# Altium project Flight Controller Core.PrjPcb (part 1 of 2)
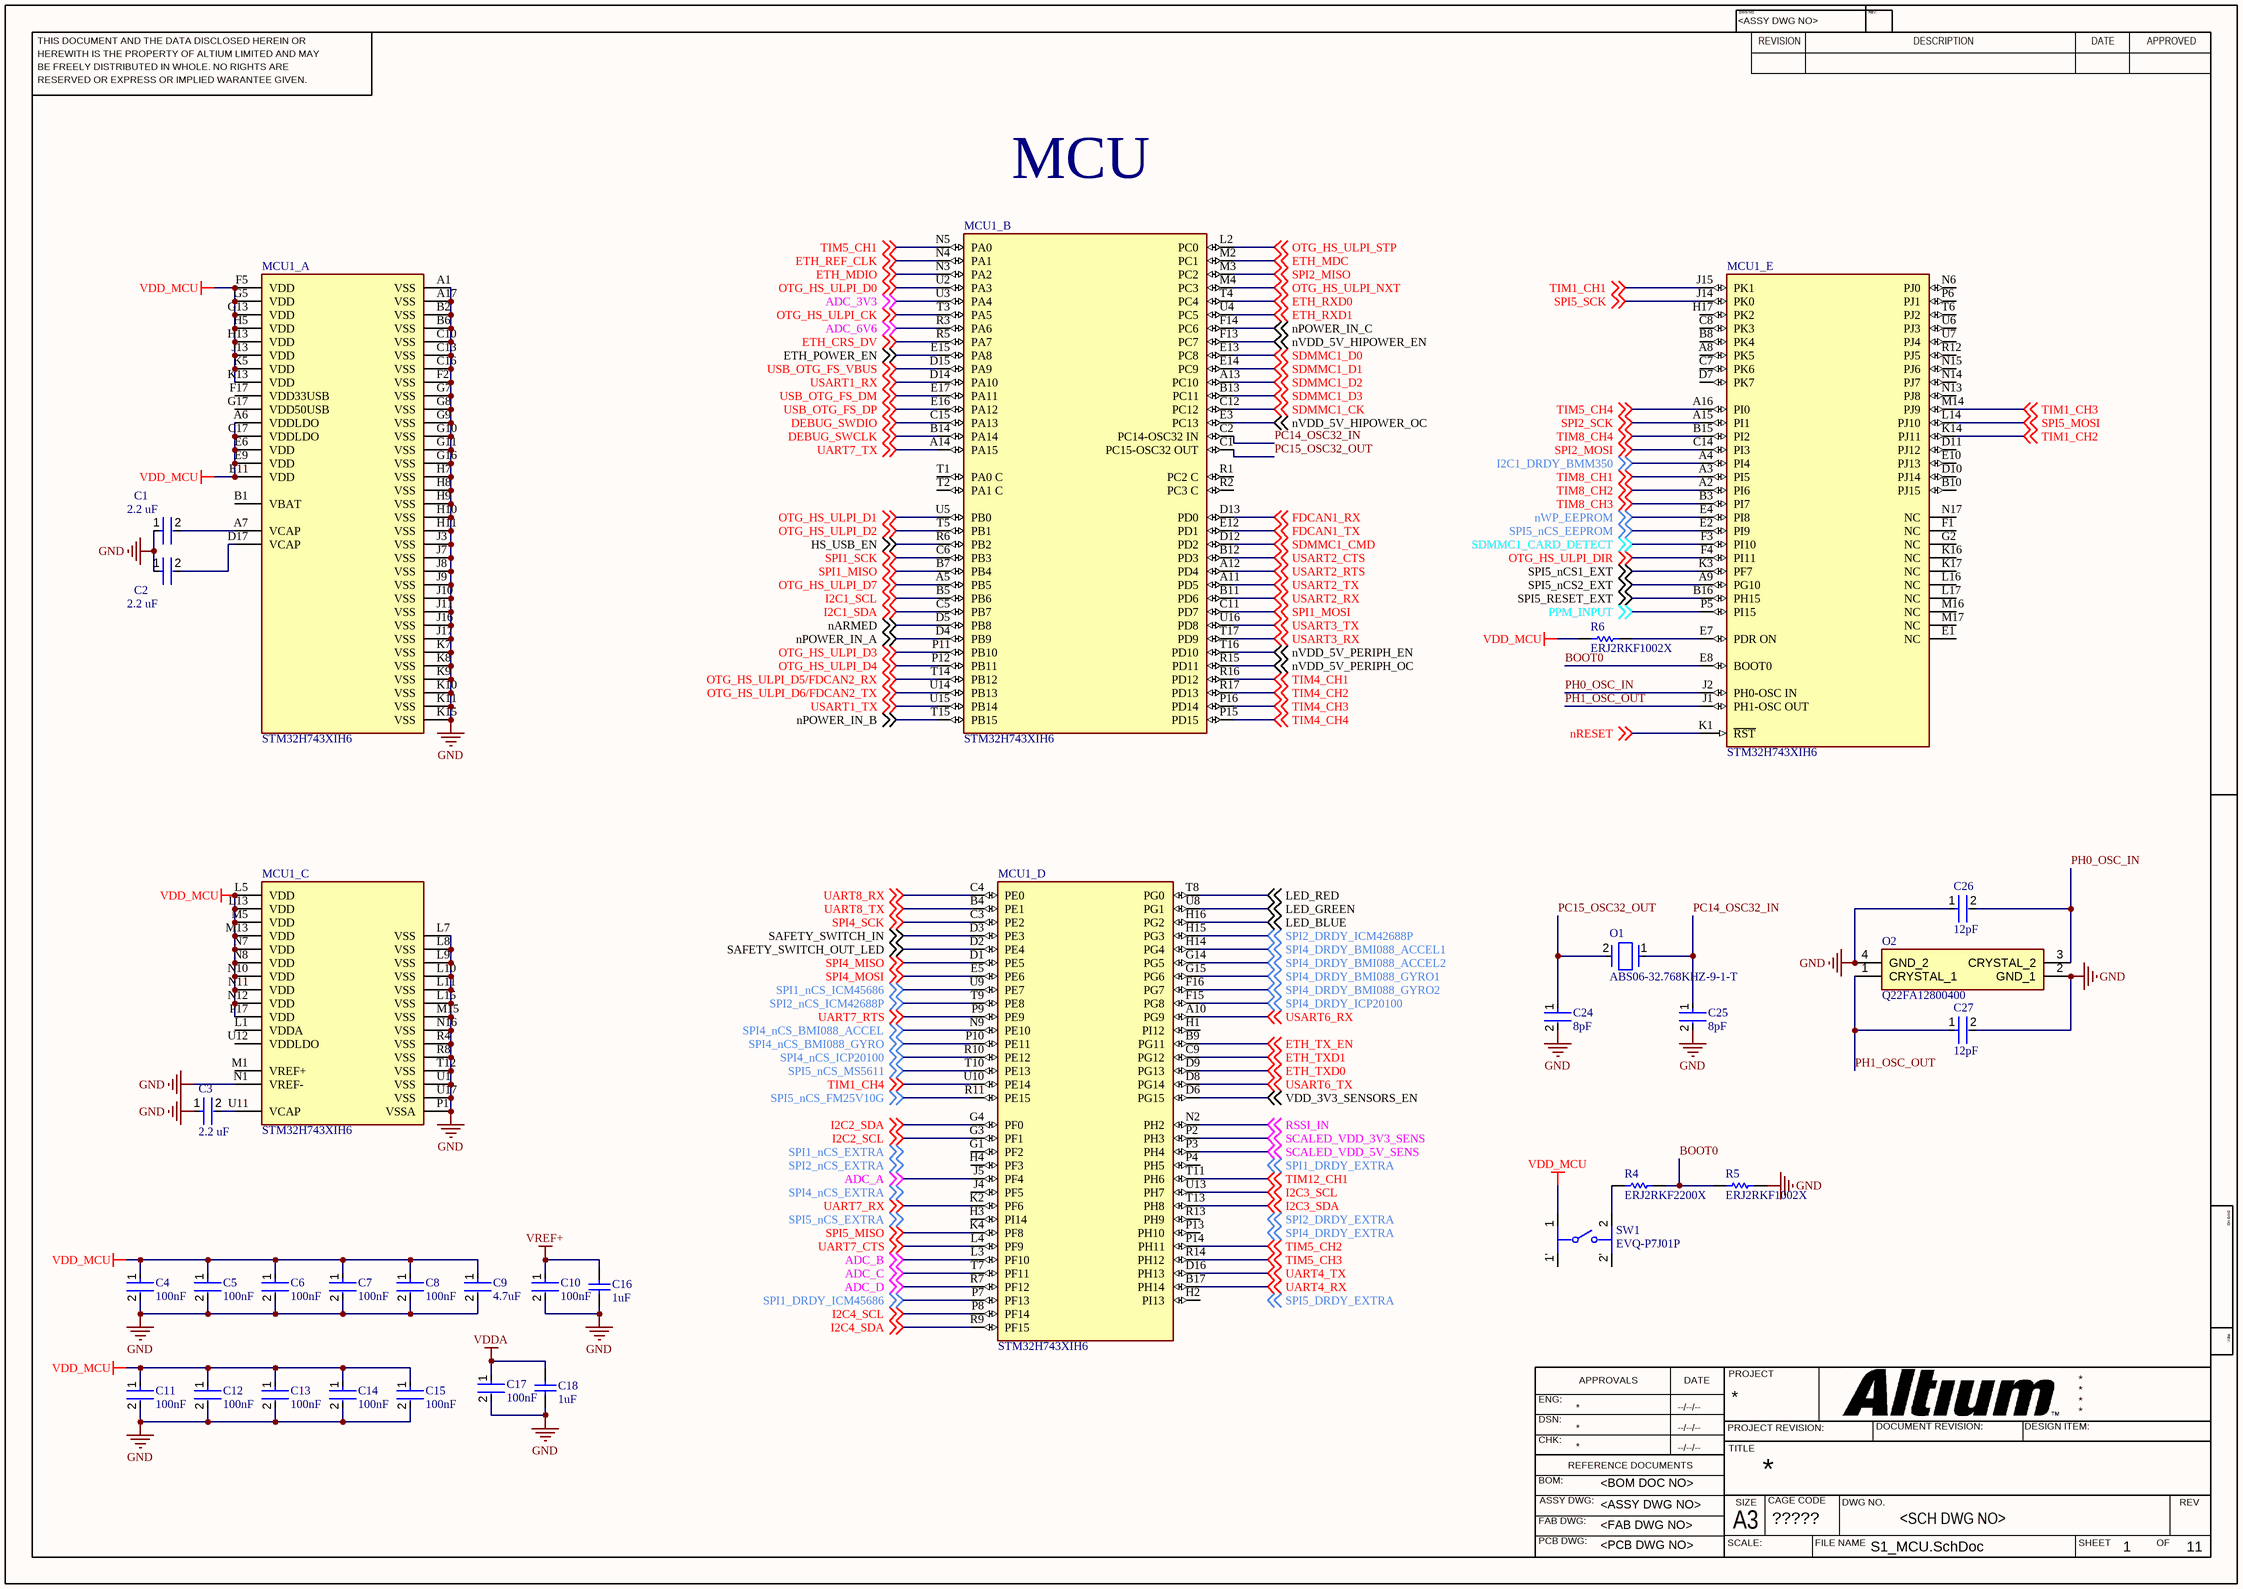
[diagram p0: S1_MCU.SchDoc]
CAGE_CODE: ?????; CONTRACT_NUMBER: <CONTRACT NO>; DOC_NO_ASSY_DWG: <ASSY DWG NO>; DOC_NO_BOM: <BOM DOC NO>; DOC_NO_FAB_DWG: <FAB DWG NO>; DOC_NO_SCH_DWG: <SCH DWG NO>; PCB_2_DEC_TOL: +/-.01; PCB_3_DEC_TOL: +/-.010; PCB_ANG_TOL: +/-1/2; PCB_ASSEMBLY_NO: <PCB ASSY NO>; PCB_CHECKER: - -----; PCB_CHECKER_APP_DATE: --/--/----; PCB_DESIGNER: - -----; PCB_DESIGNER_APP_DATE: --/--/----; PCB_DWG_NO: <PCB DWG NO>; PCB_ENGINEER: - -----; PCB_ENGINEER_APP_DATE: --/--/----; PCB_PART_NUMBER: <PCB PN>; PCB_REV: A; SCH_REV: A
12 sheets, 165 parts. Net scope: global (net labels, ports and power ports of the same name join across sheets).
Sheets:
  S1_MCU.SchDoc
  S2_Power.SchDoc
  S3_Imu.SchDoc
  S5_Memory_Ram.SchDoc
  S4_Baro_Mag.SchDoc
  S6_Pwm.SchDoc
  S7_Uart.SchDoc
  S8_Usb_Select.SchDoc
  S9_Can.SchDoc
  S10_Adc.SchDoc
  S11_Busses.SchDoc
  S12_Connectors.SchDoc

## Sheet S1_MCU.SchDoc
size 420 x 297 mm; ENG_APP_DATE: --/--/--; DSN_APP_DATE: --/--/--; CHK_APP_DATE: --/--/--; ApprovedBy: HITESH; SheetNumber: 1; SheetTotal: 11

### Parts
C1  2.2 uF  [FP-C1005-050-IPC_A]
C2  2.2 uF  [FP-C1005-050-IPC_A]
C3  2.2 uF  [FP-C1005-050-IPC_A]
C4  100nF  [FP-CC0402-MFG]
C5  100nF  [FP-CC0402-MFG]
C6  100nF  [FP-CC0402-MFG]
C7  100nF  [FP-CC0402-MFG]
C8  100nF  [FP-CC0402-MFG]
C9  4.7uF  [FP-CC0402-MFG]
C10  100nF  [FP-CC0402-MFG]
C11  100nF  [FP-CC0402-MFG]
C12  100nF  [FP-CC0402-MFG]
C13  100nF  [FP-CC0402-MFG]
C14  100nF  [FP-CC0402-MFG]
C15  100nF  [FP-CC0402-MFG]
C16  1uF  [CAPC0402(1005)60_L]
C17  100nF  [FP-CC0402-MFG]
C18  1uF  [CAPC0402(1005)60_L]
C24  8pF  [FP-GJM155-0_05-IPC_C]
C25  8pF  [FP-GJM155-0_05-IPC_C]
C26  12pF  [FP-GRM155-0_05-MFG]
C27  12pF  [FP-GRM155-0_05-MFG]
MCU1_  STM32H743XIH6  [FP-TFBGA240+25-A07U-MFG]  (parts A,B,C,D,E of 5)
O1  ABS06-32.768KHZ-9-1-T  [FP-ABS06-MFG]
O2  Q22FA12800400  [Q22FA12800400]
R4  ERJ2RKF2200X  [RESC1005X40X25LL05T05]
R5  ERJ2RKF1002X  [RESC1005X40X25LL05T05]
R6  ERJ2RKF1002X  [RESC1005X40X25LL05T05]
SW1  EVQ-P7J01P  [FP-EVQ-P7J01P-MFG]

### Nets
GND: C1.1 C2.1 C3.1 C4.2 C5.2 C6.2 C7.2 C8.2 C9.2 C10.2 C11.2 C12.2 C13.2 C14.2 C15.2 C16.2 C17.2 C18.2 C24.2 C25.2 C26.1 C27.2 MCU1_.A1(VSS) MCU1_.A17(VSS) MCU1_.B2(VSS) MCU1_.B6(VSS) MCU1_.C10(VSS) MCU1_.C13(VSS) MCU1_.C16(VSS) MCU1_.F2(VSS) MCU1_.G7(VSS) MCU1_.G8(VSS) MCU1_.G9(VSS) MCU1_.G10(VSS) MCU1_.G11(VSS) MCU1_.G16(VSS) MCU1_.H7(VSS) MCU1_.H8(VSS) MCU1_.H9(VSS) MCU1_.H10(VSS) MCU1_.H11(VSS) MCU1_.J3(VSS) MCU1_.J7(VSS) MCU1_.J8(VSS) MCU1_.J9(VSS) MCU1_.J10(VSS) MCU1_.J11(VSS) MCU1_.J16(VSS) MCU1_.J17(VSS) MCU1_.K7(VSS) MCU1_.K8(VSS) MCU1_.K9(VSS) MCU1_.K10(VSS) MCU1_.K11(VSS) MCU1_.K15(VSS) MCU1_.L7(VSS) MCU1_.L8(VSS) MCU1_.L9(VSS) MCU1_.L10(VSS) MCU1_.L11(VSS) MCU1_.L15(VSS) MCU1_.M15(VSS) MCU1_.N1(VREF-) MCU1_.N16(VSS) MCU1_.P1(VSSA) MCU1_.R4(VSS) MCU1_.R8(VSS) MCU1_.T12(VSS) MCU1_.U1(VSS) MCU1_.U17(VSS) O2.2(GND_1) O2.4(GND_2) R5.1
VDD_MCU: C4.1 C5.1 C6.1 C7.1 C8.1 C9.1 C11.1 C12.1 C13.1 C14.1 C15.1 MCU1_.A6(VDDLDO) MCU1_.C17(VDDLDO) MCU1_.E6(VDD) MCU1_.E9(VDD) MCU1_.E11(VDD) MCU1_.F5(VDD) MCU1_.G5(VDD) MCU1_.G13(VDD) MCU1_.H5(VDD) MCU1_.H13(VDD) MCU1_.J13(VDD) MCU1_.K5(VDD) MCU1_.K13(VDD) MCU1_.L5(VDD) MCU1_.L13(VDD) MCU1_.M5(VDD) MCU1_.M13(VDD) MCU1_.N7(VDD) MCU1_.N8(VDD) MCU1_.N10(VDD) MCU1_.N11(VDD) MCU1_.N12(VDD) MCU1_.P17(VDD) R6.2 SW1.1
VDDA: C17.1 C18.1
VREF+: C10.1 C16.1
ADC_3V3: MCU1_.U3(PA4) ; off-sheet ADC_3V3
ADC_6V6: MCU1_.R3(PA6) ; off-sheet ADC_6V6
ADC_A: MCU1_.J5(PF4) ; off-sheet ADC_A
ADC_B: MCU1_.L3(PF10) ; off-sheet ADC_B
ADC_C: MCU1_.T7(PF11) ; off-sheet ADC_C
ADC_D: MCU1_.R7(PF12) ; off-sheet ADC_D
BOOT0: MCU1_.E8(BOOT0) R4.2 R5.2
DEBUG_SWCLK: MCU1_.B14(PA14) ; off-sheet DEBUG_SWCLK
DEBUG_SWDIO: MCU1_.C15(PA13) ; off-sheet DEBUG_SWDIO
ETH_CRS_DV: MCU1_.R5(PA7) ; off-sheet ETH_CRS_DV
ETH_MDC: MCU1_.M2(PC1) ; off-sheet ETH_MDC
ETH_MDIO: MCU1_.N3(PA2) ; off-sheet ETH_MDIO
ETH_POWER_EN: MCU1_.E15(PA8) ; off-sheet ETH_POWER_EN
ETH_REF_CLK: MCU1_.N4(PA1) ; off-sheet ETH_REF_CLK
ETH_RXD0: MCU1_.T4(PC4) ; off-sheet ETH_RXD0
ETH_RXD1: MCU1_.U4(PC5) ; off-sheet ETH_RXD1
ETH_TX_EN: MCU1_.B9(PG11) ; off-sheet ETH_TX_EN
ETH_TXD0: MCU1_.D9(PG13) ; off-sheet ETH_TXD0
ETH_TXD1: MCU1_.C9(PG12) ; off-sheet ETH_TXD1
FDCAN1_RX: MCU1_.D13(PD0) ; off-sheet FDCAN1_RX
FDCAN1_TX: MCU1_.E12(PD1) ; off-sheet FDCAN1_TX
HS_USB_EN: MCU1_.R6(PB2) ; off-sheet HS_USB_EN
I2C1_DRDY_BMM350: MCU1_.A4(PI4) ; off-sheet I2C1_DRDY_BMM350
I2C1_SCL: MCU1_.B5(PB6) ; off-sheet I2C1_SCL
I2C1_SDA: MCU1_.C5(PB7) ; off-sheet I2C1_SDA
I2C2_SCL: MCU1_.G3(PF1) ; off-sheet I2C2_SCL
I2C2_SDA: MCU1_.G4(PF0) ; off-sheet I2C2_SDA
I2C3_SCL: MCU1_.U13(PH7) ; off-sheet I2C3_SCL
I2C3_SDA: MCU1_.T13(PH8) ; off-sheet I2C3_SDA
I2C4_SCL: MCU1_.P8(PF14) ; off-sheet I2C4_SCL
I2C4_SDA: MCU1_.R9(PF15) ; off-sheet I2C4_SDA
LED_BLUE: MCU1_.H16(PG2) ; off-sheet LED_BLUE
LED_GREEN: MCU1_.U8(PG1) ; off-sheet LED_GREEN
LED_RED: MCU1_.T8(PG0) ; off-sheet LED_RED
nARMED: MCU1_.D5(PB8) ; off-sheet nARMED
nPOWER_IN_A: MCU1_.D4(PB9) ; off-sheet nPOWER_IN_A
nPOWER_IN_B: MCU1_.T15(PB15) ; off-sheet nPOWER_IN_B
nPOWER_IN_C: MCU1_.F14(PC6) ; off-sheet nPOWER_IN_C
nRESET: MCU1_.K1(~{RST}) ; off-sheet nRESET
nVDD_5V_HIPOWER_EN: MCU1_.F13(PC7) ; off-sheet nVDD_5V_HIPOWER_EN
nVDD_5V_HIPOWER_OC: MCU1_.E3(PC13) ; off-sheet nVDD_5V_HIPOWER_OC
nVDD_5V_PERIPH_EN: MCU1_.T16(PD10) ; off-sheet nVDD_5V_PERIPH_EN
nVDD_5V_PERIPH_OC: MCU1_.R15(PD11) ; off-sheet nVDD_5V_PERIPH_OC
nWP_EEPROM: MCU1_.E4(PI8) ; off-sheet nWP_EEPROM
OTG_HS_ULPI_CK: MCU1_.T3(PA5) ; off-sheet OTG_HS_ULPI_CK
OTG_HS_ULPI_D0: MCU1_.U2(PA3) ; off-sheet OTG_HS_ULPI_D0
OTG_HS_ULPI_D1: MCU1_.U5(PB0) ; off-sheet OTG_HS_ULPI_D1
OTG_HS_ULPI_D2: MCU1_.T5(PB1) ; off-sheet OTG_HS_ULPI_D2
OTG_HS_ULPI_D3: MCU1_.P11(PB10) ; off-sheet OTG_HS_ULPI_D3
OTG_HS_ULPI_D4: MCU1_.P12(PB11) ; off-sheet OTG_HS_ULPI_D4
OTG_HS_ULPI_D5/FDCAN2_RX: MCU1_.T14(PB12) ; off-sheet OTG_HS_ULPI_D5/FDCAN2_RX
OTG_HS_ULPI_D6/FDCAN2_TX: MCU1_.U14(PB13) ; off-sheet OTG_HS_ULPI_D6/FDCAN2_TX
OTG_HS_ULPI_D7: MCU1_.A5(PB5) ; off-sheet OTG_HS_ULPI_D7
OTG_HS_ULPI_DIR: MCU1_.F4(PI11) ; off-sheet OTG_HS_ULPI_DIR
OTG_HS_ULPI_NXT: MCU1_.M4(PC3) ; off-sheet OTG_HS_ULPI_NXT
OTG_HS_ULPI_STP: MCU1_.L2(PC0) ; off-sheet OTG_HS_ULPI_STP
PC14_OSC32_IN: C25.1 MCU1_.C2(PC14-OSC32_IN) O1.1
PC15_OSC32_OUT: C24.1 MCU1_.C1(PC15-OSC32_OUT) O1.2
PH0_OSC_IN: C26.2 MCU1_.J2(PH0-OSC_IN) O2.3(CRYSTAL_2)
PH1_OSC_OUT: C27.1 MCU1_.J1(PH1-OSC_OUT) O2.1(CRYSTAL_1)
PPM_INPUT: MCU1_.P5(PI15) ; off-sheet PPM_INPUT
RSSI_IN: MCU1_.N2(PH2) ; off-sheet RSSI_IN
SAFETY_SWITCH_IN: MCU1_.D3(PE3) ; off-sheet SAFETY_SWITCH_IN
SAFETY_SWITCH_OUT_LED: MCU1_.D2(PE4) ; off-sheet SAFETY_SWITCH_OUT_LED
SCALED_VDD_3V3_SENS: MCU1_.P2(PH3) ; off-sheet SCALED_VDD_3V3_SENS
SCALED_VDD_5V_SENS: MCU1_.P3(PH4) ; off-sheet SCALED_VDD_5V_SENS
SDMMC1_CARD_DETECT: MCU1_.F3(PI10) ; off-sheet SDMMC1_CARD_DETECT
SDMMC1_CK: MCU1_.C12(PC12) ; off-sheet SDMMC1_CK
SDMMC1_CMD: MCU1_.D12(PD2) ; off-sheet SDMMC1_CMD
SDMMC1_D0: MCU1_.E13(PC8) ; off-sheet SDMMC1_D0
SDMMC1_D1: MCU1_.E14(PC9) ; off-sheet SDMMC1_D1
SDMMC1_D2: MCU1_.A13(PC10) ; off-sheet SDMMC1_D2
SDMMC1_D3: MCU1_.B13(PC11) ; off-sheet SDMMC1_D3
SPI1_DRDY_ICM45686: MCU1_.P7(PF13) ; off-sheet SPI1_DRDY_ICM45686
SPI1_MISO: MCU1_.B7(PB4) ; off-sheet SPI1_MISO
SPI1_MOSI: MCU1_.C11(PD7) ; off-sheet SPI1_MOSI
SPI1_nCS_ICM45686: MCU1_.U9(PE7) ; off-sheet SPI1_nCS_ICM45686
SPI1_SCK: MCU1_.C6(PB3) ; off-sheet SPI1_SCK
SPI2_DRDY_ICM42688P: MCU1_.H15(PG3) ; off-sheet SPI2_DRDY_ICM42688P
SPI2_MISO: MCU1_.M3(PC2) ; off-sheet SPI2_MISO
SPI2_MOSI: MCU1_.C14(PI3) ; off-sheet SPI2_MOSI
SPI2_nCS_ICM42688P: MCU1_.T9(PE8) ; off-sheet SPI2_nCS_ICM42688P
SPI2_SCK: MCU1_.A15(PI1) ; off-sheet SPI2_SCK
SPI4_DRDY_BMI088_ACCEL1: MCU1_.H14(PG4) ; off-sheet SPI4_DRDY_BMI088_ACCEL1
SPI4_DRDY_BMI088_ACCEL2: MCU1_.G14(PG5) ; off-sheet SPI4_DRDY_BMI088_ACCEL2
SPI4_DRDY_BMI088_GYRO1: MCU1_.G15(PG6) ; off-sheet SPI4_DRDY_BMI088_GYRO1
SPI4_DRDY_BMI088_GYRO2: MCU1_.F16(PG7) ; off-sheet SPI4_DRDY_BMI088_GYRO2
SPI4_DRDY_ICP20100: MCU1_.F15(PG8) ; off-sheet SPI4_DRDY_ICP20100
SPI4_MISO: MCU1_.D1(PE5) ; off-sheet SPI4_MISO
SPI4_MOSI: MCU1_.E5(PE6) ; off-sheet SPI4_MOSI
SPI4_nCS_BMI088_ACCEL: MCU1_.N9(PE10) ; off-sheet SPI4_nCS_BMI088_ACCEL
SPI4_nCS_BMI088_GYRO: MCU1_.P10(PE11) ; off-sheet SPI4_nCS_BMI088_GYRO
SPI4_nCS_ICP20100: MCU1_.R10(PE12) ; off-sheet SPI4_nCS_ICP20100
SPI4_SCK: MCU1_.C3(PE2) ; off-sheet SPI4_SCK
SPI5_MISO: MCU1_.K4(PF8) ; off-sheet SPI5_MISO
SPI5_MOSI: MCU1_.L14(PJ10) ; off-sheet SPI5_MOSI
SPI5_nCS1_EXT: MCU1_.K3(PF7) ; off-sheet SPI5_nCS1_EXT
SPI5_nCS2_EXT: MCU1_.A9(PG10) ; off-sheet SPI5_nCS2_EXT
SPI5_nCS_EEPROM: MCU1_.E2(PI9) ; off-sheet SPI5_nCS_EEPROM
SPI5_nCS_FM25V10G: MCU1_.R11(PE15) ; off-sheet SPI5_nCS_FM25V10G
SPI5_nCS_MS5611: MCU1_.T10(PE13) ; off-sheet SPI5_nCS_MS5611
SPI5_RESET_EXT: MCU1_.B16(PH15) ; off-sheet SPI5_RESET_EXT
SPI5_SCK: MCU1_.J14(PK0) ; off-sheet SPI5_SCK
TIM1_CH1: MCU1_.J15(PK1) ; off-sheet TIM1_CH1
TIM1_CH2: MCU1_.K14(PJ11) ; off-sheet TIM1_CH2
TIM1_CH3: MCU1_.M14(PJ9) ; off-sheet TIM1_CH3
TIM1_CH4: MCU1_.U10(PE14) ; off-sheet TIM1_CH4
TIM4_CH1: MCU1_.R16(PD12) ; off-sheet TIM4_CH1
TIM4_CH2: MCU1_.R17(PD13) ; off-sheet TIM4_CH2
TIM4_CH3: MCU1_.P16(PD14) ; off-sheet TIM4_CH3
TIM4_CH4: MCU1_.P15(PD15) ; off-sheet TIM4_CH4
TIM5_CH1: MCU1_.N5(PA0) ; off-sheet TIM5_CH1
TIM5_CH2: MCU1_.P14(PH11) ; off-sheet TIM5_CH2
TIM5_CH3: MCU1_.R14(PH12) ; off-sheet TIM5_CH3
TIM5_CH4: MCU1_.A16(PI0) ; off-sheet TIM5_CH4
TIM8_CH1: MCU1_.A3(PI5) ; off-sheet TIM8_CH1
TIM8_CH2: MCU1_.A2(PI6) ; off-sheet TIM8_CH2
TIM8_CH3: MCU1_.B3(PI7) ; off-sheet TIM8_CH3
TIM8_CH4: MCU1_.B15(PI2) ; off-sheet TIM8_CH4
TIM12_CH1: MCU1_.T11(PH6) ; off-sheet TIM12_CH1
UART4_RX: MCU1_.B17(PH14) ; off-sheet UART4_RX
UART4_TX: MCU1_.D16(PH13) ; off-sheet UART4_TX
UART7_CTS: MCU1_.L4(PF9) ; off-sheet UART7_CTS
UART7_RTS: MCU1_.P9(PE9) ; off-sheet UART7_RTS
UART7_RX: MCU1_.K2(PF6) ; off-sheet UART7_RX
UART7_TX: MCU1_.A14(PA15) ; off-sheet UART7_TX
UART8_RX: MCU1_.C4(PE0) ; off-sheet UART8_RX
UART8_TX: MCU1_.B4(PE1) ; off-sheet UART8_TX
USART1_RX: MCU1_.D14(PA10) ; off-sheet USART1_RX
USART1_TX: MCU1_.U15(PB14) ; off-sheet USART1_TX
USART2_CTS: MCU1_.B12(PD3) ; off-sheet USART2_CTS
USART2_RTS: MCU1_.A12(PD4) ; off-sheet USART2_RTS
USART2_RX: MCU1_.B11(PD6) ; off-sheet USART2_RX
USART2_TX: MCU1_.A11(PD5) ; off-sheet USART2_TX
USART3_RX: MCU1_.T17(PD9) ; off-sheet USART3_RX
USART3_TX: MCU1_.U16(PD8) ; off-sheet USART3_TX
USART6_RX: MCU1_.A10(PG9) ; off-sheet USART6_RX
USART6_TX: MCU1_.D8(PG14) ; off-sheet USART6_TX
USB_OTG_FS_DM: MCU1_.E17(PA11) ; off-sheet USB_OTG_FS_DM
USB_OTG_FS_DP: MCU1_.E16(PA12) ; off-sheet USB_OTG_FS_DP
USB_OTG_FS_VBUS: MCU1_.D15(PA9) ; off-sheet USB_OTG_FS_VBUS
VDD_3V3_SENSORS_EN: MCU1_.D6(PG15) ; off-sheet VDD_3V3_SENSORS_EN
NetC1_2: C1.2 MCU1_.A7(VCAP)
NetC2_2: C2.2 MCU1_.D17(VCAP)
NetC3_2: C3.2 MCU1_.U11(VCAP)
NetMCU1__E7: MCU1_.E7(PDR_ON) R6.1
NetR4_1: R4.1 SW1.2

Not connected (* = marked no-connect by the designer): MCU1_ A8(PK5) B1(VBAT) B8(PK4) B10(PJ15) C7(PK6) C8(PK3) D7(PK7) D10(PJ14) D11(PJ12) E1(NC) E10(PJ13) F1(NC) F17(VDD33USB) G1(PF2) G2(NC) G17(VDD50USB) H1(PI12) H2(PI13) H3(PI14) H4(PF3) H17(PK2) J4(PF5) K16(NC) K17(NC) L1(VDDA) L16(NC) L17(NC) M1(VREF+) M16(NC) M17(NC) N6(PJ0) N13(PJ8) N14(PJ7) N15(PJ6) N17(NC) P4(PH5) P6(PJ1) P13(PH10) R1(PC2_C) R2(PC3_C) R12(PJ5) R13(PH9) T1(PA0_C) T2(PA1_C) T6(PJ2) U6(PJ3) U7(PJ4) U12(VDDLDO); SW1 1' 2'

### Notes on the sheet
- MCU
- Labels drawn without touching a wire or pin: SPI1_DRDY_EXTRA, SPI1_nCS_EXTRA, SPI2_DRDY_EXTRA, SPI2_nCS_EXTRA, SPI4_DRDY_EXTRA, SPI4_nCS_EXTRA, SPI5_DRDY_EXTRA, SPI5_nCS_EXTRA
- THIS DOCUMENT AND THE DATA DISCLOSED HEREIN OR
- HEREWITH IS THE PROPERTY OF ALTIUM LIMITED AND MAY
- DWG NO:
- REVISION
- REV:
- DESCRIPTION
- DATE
- APPROVED
- BE FREELY DISTRIBUTED IN WHOLE. NO RIGHTS ARE
- RESERVED OR EXPRESS OR IMPLIED WARANTEE GIVEN.
- ENG:
- APPROVALS
- PROJECT
- DSN:
- CHK:
- REFERENCE DOCUMENTS
- PROJECT REVISION:
- TITLE
- DOCUMENT REVISION:
- DESIGN ITEM:
- BOM:
- FAB DWG:
- PCB DWG:
- ASSY DWG:
- SCALE:
- A3
- SIZE
- CAGE CODE
- FILE NAME
- DWG NO.
- SHEET
- OF
- REV

### Library data of the parts
C1-C3 = CMP-08246-004339-1: CAP CER 2.2UF 25V X5R 0402; Dielectric Material: Ceramic; Tolerance: 10%; REACH SVHC: No SVHC; Weight: 2.3E-05oz; Capacitance: 2.2uF; Length: 1mm; RoHS Compliant: Yes; Package Quantity: 1; Voltage Rating (DC): 25V; Dielectric: X5R; Series: C; Voltage Rating: 25V; Case Code (Imperial): 0402; Min Operating Temperature: -55°C; Depth: 0.5mm; Resistor Type: Ceramic; Height: 0.5mm; Width: 0.5mm; Mount: Surface Mount; Case Code (Metric): 1005; Case/Package: 0402; Max Operating Temperature: 85°C; Thickness: 0.022inch; Lead Free: Lead Free; Termination: SMD/SMT; Packaging: Tape and Reel
C4-C8 C10-C15 C17 = CMP-03422-001121-1: CAP CER 0.1UF 16V X7R 0402; Manufacturer: YAGEO; Manufacturer Part Number: CC0402KPX7R7BB104; Material: Ceramic; Temperature Coefficient: 30ppm/°C; Automotive Grade: NA; Tolerance: 0.1; Digikey Description: CAP CER 0.1UF 16V X7R 0402; Temperature Range Low: -55°C; Footprint Url: http://www.yageo.com/exep/pages/download/literatures/UPY-C_GEN_24.pdf; RoHS: TRUE; Device Class L3: Ceramic Capacitors; Temperature Characteristic: X7R; Capacitance: 100 nF; Package: CC0402; Device Class L1: Passive Components; Lead Free: Yes; Temperature Range High: +125°C; Category: Cap; Mouser Description: 0402 0.1 uF 16 V ±10% Tolerance X7R SMT Multilayer Ceramic Capacitor; Voltage Rating: 16 V; Value: 100 nF; ComponentLink2Description: Datasheet; Automotive: No; Octopart: https://octopart.com/cc0402kpx7r7bb104-yageo-21548559; ComponentLink2URL: http://www.yageo.com/documents/recent/UPY-GP_NP0_16V-to-50V_16.pdf; Height: 0.55mm; Device Class L2: Capacitors; Temperature: -55°C to +125°C; Ipc Land Pattern Name: CAPC10050X50
C9 = CMP-1034-02137-2: CAP CER 4.7UF 6.3V X5R 0402; Manufacturer: YAGEO; Manufacturer Part Number: CC0402MRX5R5BB475; Temperature Coefficient: 30ppm/°C; Tolerance: 0.2; Automotive Grade: NA; Material: Ceramic; Automotive: No; Temperature: -55°C to +125°C; Category: Cap; Ipc Land Pattern Name: CAPC10050X50; Digikey Description: CAP CER 4.7UF 6.3V X5R 0402; ComponentLink2Description: Datasheet; Octopart: https://octopart.com/cc0402mrx5r5bb475-yageo-20021081; Mouser Description: Multilayer Ceramic Capacitors MLCC - SMD/SMT 4.7uF 6.3V X5R 20%; Device Class L1: Passive Components; Footprint Url: http://www.yageo.com/exep/pages/download/literatures/UPY-C_GEN_24.pdf; Value: 4.7 uF; Temperature Range High: +125°C; ComponentLink2URL: http://www.yageo.com/documents/recent/UPY-GP_NP0_16V-to-50V_16.pdf; Voltage Rating: 6.3 V; Height: 0.55mm; RoHS: TRUE; Package: CC0402; Device Class L3: Ceramic Capacitors; Temperature Characteristic: X5R; Temperature Range Low: -55°C; Capacitance: 4.7 uF; Device Class L2: Capacitors; Lead Free: Yes
C16 C18 = CMP-1034-02115-1: CAP 1uF 6.3V -20% to +80% 0402 (1005 Metric) Thickness 0.6mm SMD; Case-EIA: 0402; Case-Metric: 1005; Rated Voltage: 6.3 V; Tolerance: -20% to +80%; Technology: SMT; Max Thickness: 0.6 mm; Value: 1uF
C24 C25 = CMP-2008-03759-2: Multi-Layer Ceramic Capacitor 8pF C0G  ±0.25pF 0402 Paper T/R; Voltage Rating (DC): 50V; Termination: SMD/SMT; Dielectric: C0G; Packaging: Tape and Reel; Width: 0.02inch; Thickness: 0.022inch; Case Code (Imperial): 0402; Min Operating Temperature: -55°C; Case Code (Metric): 1005; Voltage Rating: 50V; Capacitance: 8pF; Package Quantity: 1; Lead Free: Lead Free; Max Operating Temperature: 125°C; Mount: Surface Mount; Depth: 0.5mm; Height: 0.5mm; Radiation Hardening: No; Case/Package: 0402; Length: 1mm
C26 C27 = CMP-2008-03945-2: CAP CER 12PF 50V C0G/NP0 0402; Tolerance: 2%; Dielectric: C0G; Material: Ceramic; Termination: SMD/SMT; Mount: Surface Mount; REACH SVHC: No SVHC; Depth: 0.5mm; Case Code (Metric): 1005; Voltage Rating: 50V; Height: 0.5mm; Voltage Rating (DC): 50V; Case Code (Imperial): 0402; Package Quantity: 10000; Construction: Flat; Thickness: 0.022inch; Length: 1mm; Min Operating Temperature: -55°C; Width: 0.5mm; Lead Free: Lead Free; Capacitance: 12pF; Case/Package: 0402; Packaging: Tape and Reel; Series: GRM; Voltage: 50V; Radiation Hardening: No; Max Operating Temperature: 125°C
MCU1_ = CMP-12105-000122-1: IC MCU 32BIT 2MB FLASH TFBGA; Number of I/Os: 168; Core Architecture: ARM; Frequency: 400MHz; Oscillator Type: Internal; Interface: I2C; Peripherals: Brown-out Detect/Reset; Memory Type: FLASH; Packaging: Tray; Min Operating Temperature: -40°C; Max Operating Temperature: 85°C; Memory Size: 2MB; Case/Package: TFBGA; RoHS Compliant: Yes
O1 = CMP-27762-003430-2: Crystal 32.768kHz ±10ppm (Tol) 9pF FUND 90kΩ 2-Pin Mini-CSMD T/R; Series Resistance: 90kR; Series: ABS06; Case/Package: CSMD; Package Quantity: 3000; Load Capacitance: 9pF; Number of Pins: 2; Tolerance: 10ppm; RoHS Compliant: Yes; Depth: 1.2mm; Termination: SMD/SMT; Min Operating Temperature: -40°C; Length: 2mm; Packaging: Tape and Reel; Max Operating Temperature: 85°C; Frequency Tolerance: 10ppm; Width: 1.2mm; ESR (Equivalent Series Resistance): 90kR; Radiation Hardening: No; Frequency: 32.768kHz; REACH SVHC: No SVHC; Mount: Surface Mount; Height: 0.6mm
O2 = Q22FA12800400: Crystal or Oscillator; Manufacturer_Name: Seiko Epson Corporation; Datasheet Link: https://datasheet.lcsc.com/szlcsc/Seiko-Epson-Q22FA12800400_C255875.pdf; Height: 0.5mm; Manufacturer_Part_Number: Q22FA12800400
R4 = CMP-2002-01131-1: Manufacturer: Panasonic; Part Number: ERJ2RKF2200X
R5 R6 = CMP-2000-07588-1: Chip Resistor, 10 KOhm, +/- 1%, 0.1 W, -55 to 155 degC, 0402 (1005 Metric), RoHS, Tape and Reel; Manufacturer: Panasonic; Power Rating: 100mW; Voltage Rating: 50V; Resistance: 10KOhm; Case\/Package: 0402; Temperature Coefficient: 100ppm\/degreesC; RoHSCompliant: True; Lead Free: LeadFree; Package Quantity: 1; Contact Plating: Tin; Length: 1mm; Radiation Hardening: No; REACH SVHC: NoSVHC; Max Operating Temperature: 155degC; Depth: 0.5mm; Case Code (Imperial): 0402; Military Standard: Not; Package Description: 2-Pin Surface Mount Device, Body 1 x 0.5 mm; Termination: SMD/SMT; Case Code (Metric): 1005; Height: 0.35mm; Packaging: TapeandReel; Voltage Rating (DC): 50V; Package Reference: 402; Number of Pins: 2; Tolerance: 1%; Mounting Technology: SurfaceMount; Width: 0.02inch; Mount: SurfaceMount; Datasheet URL: https://industrial.panasonic.com/cdbs/www-data/pdf/RDA0000/AOA0000C304.pdf; Composition: ThickFilm; Datasheet Version: 02/2017; Manufacturer URL: http://www.panasonic.com/; Max Power Dissipation: 100mW; Number of Terminations: 2; Min Operating Temperature: -55degC
SW1 = CMP-05618-000001-1: SWITCH TACTILE SPST-NO 0.05A 12V; Manufacturer: Panasonic; Operating Force: 1.6N; Contact Current Rating: 50mA; Electromechanical Life: 100000Cycles; Contact Resistance: 500mΩ; Height: 1.55mm; Temperature Range Low: -20°C; Device Class L1: Electromechanical; Package: 0; RoHS: TRUE; Category: Switch; ComponentLink2Description: Datasheet; Device Class L2: Switches; Temperature Range High: +70°C; Mount: Surface Mount; Device Class L3: Tactile Switches; Temperature: -20°C to +70°C; Automotive: No; Manufacturer Part Number: EVQ-P7J01P; Mouser Description: Tactile Switches 3.5x2.9mm Right Ang Light Touch Switch; ComponentLink2URL: https://b2b-api.panasonic.eu/file_stream/pids/fileversion/2431; Lead Free: Yes; Octopart: https://octopart.com/evq-p7j01p-panasonic-29917078; Digikey Description: SWITCH TACTILE SPST-NO 0.05A 12V; Voltage Rating Dc: 12V; Throw Configuration: SPST-NO

## Sheet S2_Power.SchDoc
size 420 x 297 mm; SheetNumber: 2; SheetTotal: 11
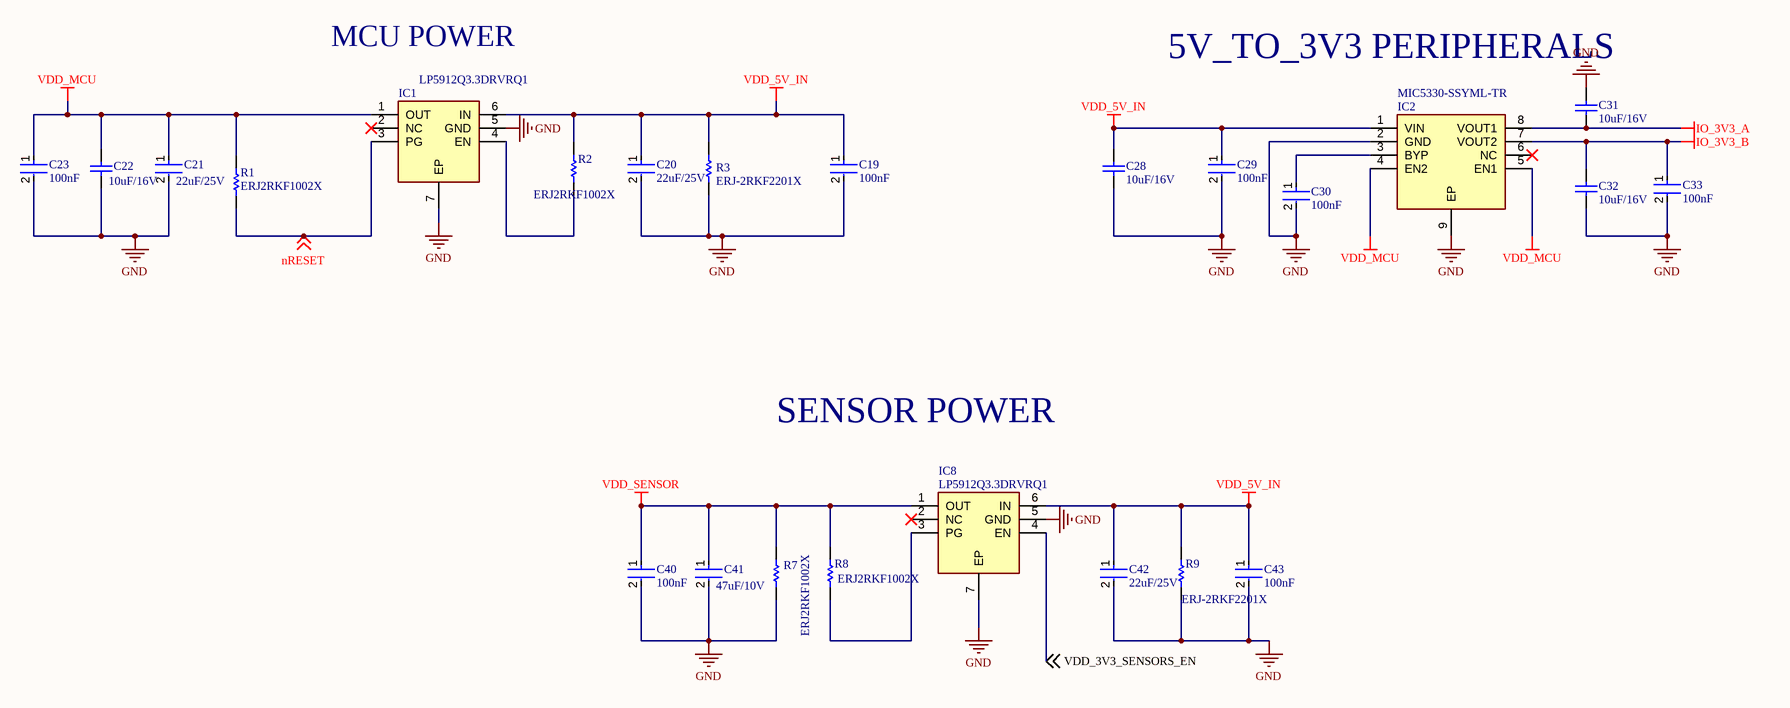
[diagram p1: S2_Power.SchDoc]

### Parts
C19  100nF  [FP-CC0402-MFG]
C20  22uF/25V  [FP-MK325M-MFG]
C21  22uF/25V  [FP-MK325M-MFG]
C22  10uF/16V  [CAPC1210(3225)210_L]
C23  100nF  [FP-CC0402-MFG]
C28  10uF/16V  [CAPC1210(3225)210_L]
C29  100nF  [FP-CC0402-MFG]
C30  100nF  [FP-CC0402-MFG]
C31  10uF/16V  [CAPC1210(3225)210_L]
C32  10uF/16V  [CAPC1210(3225)210_L]
C33  100nF  [FP-CC0402-MFG]
C40  100nF  [FP-CC0402-MFG]
C41  47uF/10V  [FP-C2012-125-0_2-IPC_B]
C42  22uF/25V  [FP-MK325M-MFG]
C43  100nF  [FP-CC0402-MFG]
IC1  LP5912Q3.3DRVRQ1  [SON65P200X200X80-7N]
IC2  MIC5330-SSYML-TR  [SON50P200X200X95-9N-D]
IC8  LP5912Q3.3DRVRQ1  [SON65P200X200X80-7N]
R1  ERJ2RKF1002X  [RESC1005X40X25LL05T05]
R2  ERJ2RKF1002X  [RESC1005X40X25LL05T05]
R3  ERJ-2RKF2201X  [RESC1005X40X25LL05T05]
R7  ERJ2RKF1002X  [RESC1005X40X25LL05T05]
R8  ERJ2RKF1002X  [RESC1005X40X25LL05T05]
R9  ERJ-2RKF2201X  [RESC1005X40X25LL05T05]

### Nets
GND: C19.2 C20.2 C21.2 C22.1 C23.2 C28.1 C29.2 C30.2 C31.1 C32.1 C33.2 C40.2 C41.2 C42.2 C43.2 IC1.5(GND) IC1.7(EP) IC2.2(GND) IC2.9(EP) IC8.5(GND) IC8.7(EP) R3.1 R7.1 R9.1
IO_3V3_A: C31.2 IC2.8(VOUT1)
IO_3V3_B: C32.2 C33.1 IC2.7(VOUT2)
VDD_5V_IN: C19.1 C20.1 C28.2 C29.1 C42.1 C43.1 IC1.6(IN) IC2.1(VIN) IC8.6(IN) R2.2 R3.2 R9.2
VDD_MCU: C21.1 C22.2 C23.1 IC1.1(OUT) IC2.4(EN2) IC2.5(EN1) R1.2
VDD_SENSOR: C40.1 C41.1 IC8.1(OUT) R7.2 R8.2
nRESET: IC1.3(PG) R1.1 ; off-sheet nRESET
VDD_3V3_SENSORS_EN: IC8.4(EN) ; off-sheet VDD_3V3_SENSORS_EN
NetC30_1: C30.1 IC2.3(BYP)
NetIC1_4: IC1.4(EN) R2.1
NetIC8_3: IC8.3(PG) R8.1

Not connected (* = marked no-connect by the designer): IC1 2(NC)*; IC2 6(NC)*; IC8 2(NC)*

### Notes on the sheet
- MCU POWER
- 5V_TO_3V3 PERIPHERALS
- SENSOR POWER
- THIS DOCUMENT AND THE DATA DISCLOSED HEREIN OR
- HEREWITH IS THE PROPERTY OF ALTIUM LIMITED AND MAY
- DWG NO:
- REVISION
- REV:
- DESCRIPTION
- DATE
- APPROVED
- BE FREELY DISTRIBUTED IN WHOLE. NO RIGHTS ARE
- RESERVED OR EXPRESS OR IMPLIED WARANTEE GIVEN.
- ENG:
- APPROVALS
- PROJECT
- DSN:
- CHK:
- REFERENCE DOCUMENTS
- PROJECT REVISION:
- TITLE
- DOCUMENT REVISION:
- DESIGN ITEM:
- BOM:
- FAB DWG:
- PCB DWG:
- ASSY DWG:
- SCALE:
- A3
- SIZE
- CAGE CODE
- FILE NAME
- DWG NO.
- SHEET
- OF
- REV
- (in symbol CMP-1058-00037-1, part A) 7, 8
- (in symbol CMP-1058-00037-1, part B) 5, 6

### Library data of the parts
C19 C23 C29 C30 C33 C40 C43 = CMP-03422-001121-1: as C4 on sheet S1_MCU; Digikey Description: CAP CER 0.1UF 16V X7R 0402; Temperature Range Low: -55°C; Footprint Url: http://www.yageo.com/exep/pages/download/literatures/UPY-C_GEN_24.pdf; RoHS: TRUE; Device Class L3: Ceramic Capacitors; Temperature Characteristic: X7R; Capacitance: 100 nF; Package: CC0402; Device Class L1: Passive Components; Lead Free: Yes; Temperature Range High: +125°C; Category: Cap; Mouser Description: 0402 0.1 uF 16 V ±10% Tolerance X7R SMT Multilayer Ceramic Capacitor; Voltage Rating: 16 V; Value: 100 nF; ComponentLink2Description: Datasheet; Automotive: No; Octopart: https://octopart.com/cc0402kpx7r7bb104-yageo-21548559; ComponentLink2URL: http://www.yageo.com/documents/recent/UPY-GP_NP0_16V-to-50V_16.pdf; Height: 0.55mm; Device Class L2: Capacitors; Temperature: -55°C to +125°C; Ipc Land Pattern Name: CAPC10050X50
C20 C21 C42 = CMP-14477-000145-1: CAP CER 22UF 25V X5R 1210; Tolerance: 20%; Width: 0.098inch; Thickness: 0.106inch; Depth: 2.5mm; Packaging: Tape and Reel; Max Operating Temperature: 85°C; Termination: SMD/SMT; Case Code (Imperial): 1210; Height: 2.5mm; Case/Package: 1210; Voltage Rating: 25V; Package Quantity: 1; Min Operating Temperature: -55°C; Capacitance: 22uF; Halogen Free: Halogen Free; Case Code (Metric): 3225; Mount: Surface Mount; Construction: Flat; Radiation Hardening: No; Length: 3.2mm; Voltage Rating (DC): 25V; Contact Plating: Nickel; Number of Pins: 2; Dielectric: X5R; RoHS Compliant: Yes; Resistor Type: Ceramic; Series: M
C22 C28 C31 C32 = CMP-1038-02215-1: CAP 10uF 16V ±20% 1210 (3225 Metric) Thickness 2.1mm SMD; Case-EIA: 1210; Tolerance: Â±20%; Case-Metric: 3225; Max Thickness: 2.1 mm; Rated Voltage: 16 V; Value: 10uF; Technology: SMT
C41 = CMP-2000-05451-2: Multilayer Ceramic Capacitors 47μF ±20% 10V X5R SMD 0805; Capacitance: 47uF; RoHS Compliant: Yes; Dielectric: X5R; Case Code (Imperial): 0805; Min Operating Temperature: -55°C; Length: 2mm; Voltage Rating: 10V; Lead Free: Lead Free; Weight: 0.000194oz; Resistor Type: Ceramic; Dielectric Material: Ceramic; Max Operating Temperature: 85°C; Height: 1.25mm; Width: 0.049inch; Depth: 1.25mm; Termination: SMD/SMT; Case/Package: 0805; Voltage Rating (DC): 10V; Voltage: 10V; Thickness: 0.057inch; Tolerance: 20%; REACH SVHC: No SVHC; Package Quantity: 1; Series: C; Case Code (Metric): 2012; Mount: Surface Mount; Packaging: Tape and Reel
IC1 IC8 = LP5912Q3.3DRVRQ1: Integrated Circuit; Manufacturer_Name: Texas Instruments; Datasheet Link: http://www.ti.com/lit/gpn/lp5912-q1; Height: 0.8mm; Manufacturer_Part_Number: LP5912Q3.3DRVRQ1; Mouser Part Number: 595-LP5912Q3.3DRVRQ1; Mouser Price/Stock: https://www.mouser.co.uk/ProductDetail/Texas-Instruments/LP5912Q3.3DRVRQ1?qs=n%252BTO0c4TDSb%252BK5JhyfAoLw%3D%3D
IC2 = MIC5330-SSYML-TR: Integrated Circuit; Manufacturer_Name: Microchip; Datasheet Link: http://www.microchip.com/mymicrochip/filehandler.aspx?ddocname=en579824; Height: 0.95mm; Manufacturer_Part_Number: MIC5330-SSYML-TR; Mouser Part Number: 998-MIC5330-SSYMLTR; Mouser Price/Stock: https://www.mouser.co.uk/ProductDetail/Microchip-Technology/MIC5330-SSYML-TR?qs=U6T8BxXiZAVlV%252Bccuslf5g%3D%3D; Arrow Part Number: MIC5330-SSYML-TR; Arrow Price/Stock: https://www.arrow.com/en/products/mic5330-ssyml-tr/microchip-technology?region=nac
R1 R2 R7 R8 = CMP-2000-07588-1: as R5 on sheet S1_MCU; RoHSCompliant: True; Lead Free: LeadFree; Package Quantity: 1; Contact Plating: Tin; Length: 1mm; Radiation Hardening: No; REACH SVHC: NoSVHC; Max Operating Temperature: 155degC; Depth: 0.5mm; Case Code (Imperial): 0402; Military Standard: Not; Package Description: 2-Pin Surface Mount Device, Body 1 x 0.5 mm; Termination: SMD/SMT; Case Code (Metric): 1005; Height: 0.35mm; Packaging: TapeandReel; Voltage Rating (DC): 50V; Package Reference: 402; Number of Pins: 2; Tolerance: 1%; Mounting Technology: SurfaceMount; Width: 0.02inch; Mount: SurfaceMount; Datasheet URL: https://industrial.panasonic.com/cdbs/www-data/pdf/RDA0000/AOA0000C304.pdf; Composition: ThickFilm; Datasheet Version: 02/2017; Manufacturer URL: http://www.panasonic.com/; Max Power Dissipation: 100mW; Number of Terminations: 2; Min Operating Temperature: -55degC
R3 R9 = CMP-2002-01132-2: Precision Thick Film Chip Resistor, 2.2 kOhm, 100 mW, 1%, -55 to 155 degC, 2-Pin SMD (0402), RoHS, Tape and Reel; Manufacturer: Panasonic; Resistance: 2.2kO; Temp Coefficient: ±100ppm/°C; Rated Power: 0.1W; Datasheet URL: https://datasheet.ciiva.com/11821/0900766b80f80784-11821273.pdf; Tolerance (%): ±1%; Mounting Technology: SurfaceMount; Package Description: 2-Pin Surface Mount Device, Body 1 x 0.5 mm; Manufacturer URL: http://www.panasonic.com/; Datasheet Version: 03/2011; Package Reference: 0402; Size Code: 0402

## Sheet S3_Imu.SchDoc
size 420 x 297 mm; SheetNumber: 3; SheetTotal: 11
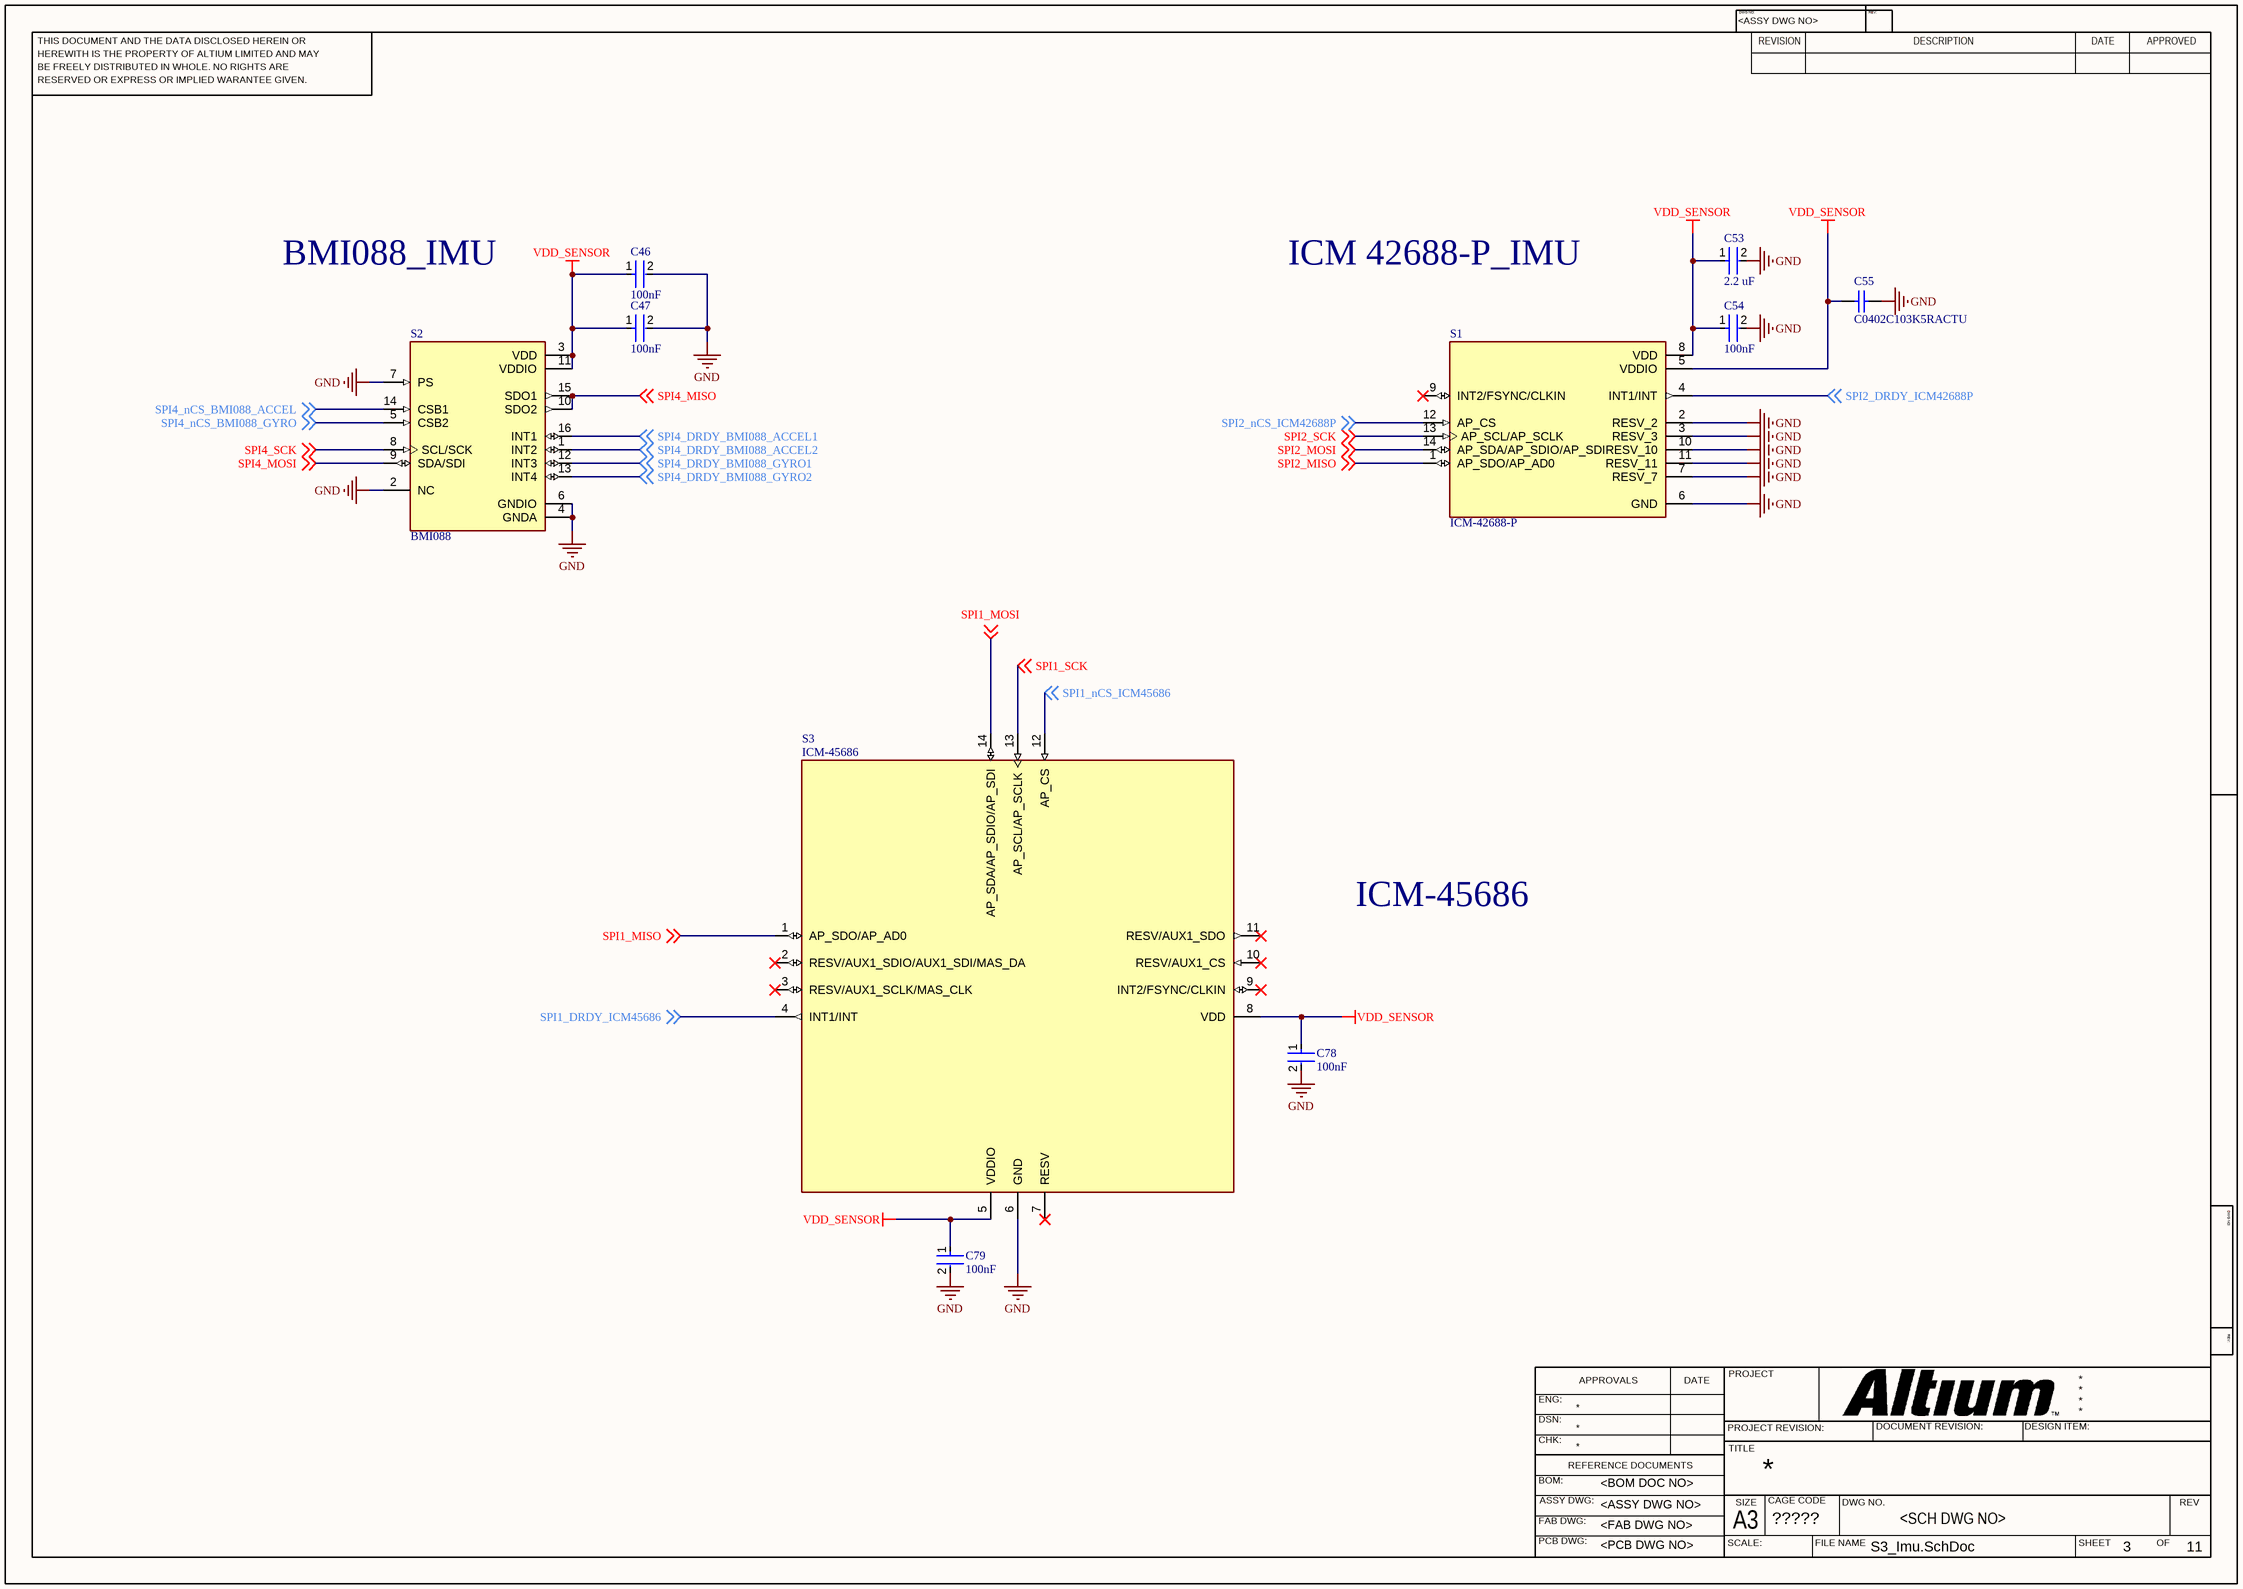
[diagram p2: S3_Imu.SchDoc]

### Parts
C46  100nF  [FP-CC0402-MFG]
C47  100nF  [FP-CC0402-MFG]
C53  2.2 uF  [FP-C1005-050-IPC_A]
C54  100nF  [FP-CC0402-MFG]
C55  C0402C103K5RACTU  [CAPC1005X55X30LL05T10]
C78  100nF  [FP-CC0402-MFG]
C79  100nF  [FP-CC0402-MFG]
S1  ICM-42688-P  [PQFN50P300X250X97-14N]
S2  BMI088  [PQFN50P450X300X100-16N]
S3  ICM-45686  [IC_ICM-45686]

### Nets
GND: C46.2 C47.2 C53.2 C54.2 C55.2 C78.2 C79.2 S1.2(RESV_2) S1.3(RESV_3) S1.6(GND) S1.7(RESV_7) S1.10(RESV_10) S1.11(RESV_11) S2.2(NC) S2.4(GNDA) S2.6(GNDIO) S2.7(PS) S3.6(GND)
VDD_SENSOR: C46.1 C47.1 C53.1 C54.1 C55.1 C78.1 C79.1 S1.5(VDDIO) S1.8(VDD) S2.3(VDD) S2.11(VDDIO) S3.5(VDDIO) S3.8(VDD)
SPI1_DRDY_ICM45686: S3.4(INT1/INT) ; off-sheet SPI1_DRDY_ICM45686
SPI1_MISO: S3.1(AP_SDO/AP_AD0) ; off-sheet SPI1_MISO
SPI1_MOSI: S3.14(AP_SDA/AP_SDIO/AP_SDI) ; off-sheet SPI1_MOSI
SPI1_nCS_ICM45686: S3.12(AP_CS) ; off-sheet SPI1_nCS_ICM45686
SPI1_SCK: S3.13(AP_SCL/AP_SCLK) ; off-sheet SPI1_SCK
SPI2_DRDY_ICM42688P: S1.4(INT1/INT) ; off-sheet SPI2_DRDY_ICM42688P
SPI2_MISO: S1.1(AP_SDO/AP_AD0) ; off-sheet SPI2_MISO
SPI2_MOSI: S1.14(AP_SDA/AP_SDIO/AP_SDI) ; off-sheet SPI2_MOSI
SPI2_nCS_ICM42688P: S1.12(AP_CS) ; off-sheet SPI2_nCS_ICM42688P
SPI2_SCK: S1.13(AP_SCL/AP_SCLK) ; off-sheet SPI2_SCK
SPI4_DRDY_BMI088_ACCEL1: S2.16(INT1) ; off-sheet SPI4_DRDY_BMI088_ACCEL1
SPI4_DRDY_BMI088_ACCEL2: S2.1(INT2) ; off-sheet SPI4_DRDY_BMI088_ACCEL2
SPI4_DRDY_BMI088_GYRO1: S2.12(INT3) ; off-sheet SPI4_DRDY_BMI088_GYRO1
SPI4_DRDY_BMI088_GYRO2: S2.13(INT4) ; off-sheet SPI4_DRDY_BMI088_GYRO2
SPI4_MISO: S2.10(SDO2) S2.15(SDO1) ; off-sheet SPI4_MISO
SPI4_MOSI: S2.9(SDA/SDI) ; off-sheet SPI4_MOSI
SPI4_nCS_BMI088_ACCEL: S2.14(CSB1) ; off-sheet SPI4_nCS_BMI088_ACCEL
SPI4_nCS_BMI088_GYRO: S2.5(CSB2) ; off-sheet SPI4_nCS_BMI088_GYRO
SPI4_SCK: S2.8(SCL/SCK) ; off-sheet SPI4_SCK

Not connected (* = marked no-connect by the designer): S1 9(INT2/FSYNC/CLKIN)*; S3 2(RESV/AUX1_SDIO/AUX1_SDI/MAS_DA)* 3(RESV/AUX1_SCLK/MAS_CLK)* 7(RESV)* 9(INT2/FSYNC/CLKIN)* 10(RESV/AUX1_CS)* 11(RESV/AUX1_SDO)*

### Notes on the sheet
- BMI088_IMU
- ICM 42688-P_IMU
- ICM-45686
- THIS DOCUMENT AND THE DATA DISCLOSED HEREIN OR
- HEREWITH IS THE PROPERTY OF ALTIUM LIMITED AND MAY
- DWG NO:
- REVISION
- REV:
- DESCRIPTION
- DATE
- APPROVED
- BE FREELY DISTRIBUTED IN WHOLE. NO RIGHTS ARE
- RESERVED OR EXPRESS OR IMPLIED WARANTEE GIVEN.
- ENG:
- APPROVALS
- PROJECT
- DSN:
- CHK:
- REFERENCE DOCUMENTS
- PROJECT REVISION:
- TITLE
- DOCUMENT REVISION:
- DESIGN ITEM:
- BOM:
- FAB DWG:
- PCB DWG:
- ASSY DWG:
- SCALE:
- A3
- SIZE
- CAGE CODE
- FILE NAME
- DWG NO.
- SHEET
- OF
- REV

### Library data of the parts
C46 C47 C54 C78 C79 = CMP-03422-001121-1: as C4 on sheet S1_MCU; Digikey Description: CAP CER 0.1UF 16V X7R 0402; Temperature Range Low: -55°C; Footprint Url: http://www.yageo.com/exep/pages/download/literatures/UPY-C_GEN_24.pdf; RoHS: TRUE; Device Class L3: Ceramic Capacitors; Temperature Characteristic: X7R; Capacitance: 100 nF; Package: CC0402; Device Class L1: Passive Components; Lead Free: Yes; Temperature Range High: +125°C; Category: Cap; Mouser Description: 0402 0.1 uF 16 V ±10% Tolerance X7R SMT Multilayer Ceramic Capacitor; Voltage Rating: 16 V; Value: 100 nF; ComponentLink2Description: Datasheet; Automotive: No; Octopart: https://octopart.com/cc0402kpx7r7bb104-yageo-21548559; ComponentLink2URL: http://www.yageo.com/documents/recent/UPY-GP_NP0_16V-to-50V_16.pdf; Height: 0.55mm; Device Class L2: Capacitors; Temperature: -55°C to +125°C; Ipc Land Pattern Name: CAPC10050X50
C53 = CMP-08246-004339-1: as C1 on sheet S1_MCU; REACH SVHC: No SVHC; Weight: 2.3E-05oz; Capacitance: 2.2uF; Length: 1mm; RoHS Compliant: Yes; Package Quantity: 1; Voltage Rating (DC): 25V; Dielectric: X5R; Series: C; Voltage Rating: 25V; Case Code (Imperial): 0402; Min Operating Temperature: -55°C; Depth: 0.5mm; Resistor Type: Ceramic; Height: 0.5mm; Width: 0.5mm; Mount: Surface Mount; Case Code (Metric): 1005; Case/Package: 0402; Max Operating Temperature: 85°C; Thickness: 0.022inch; Lead Free: Lead Free; Termination: SMD/SMT; Packaging: Tape and Reel
C55 = CMP-1034-01886-2: Manufacturer: Kemet; Part Number: C0402C103K5RACTU
S1 = CMP-010-00026-1: Accelerometer, Gyroscope, 6 Axis Sensor Output; MP: ICM-42688-P; Source: ICM-42688-P.SchLib; Pins: 14; Availability: Unavailable; Price: None; Value: *; Component Type: Standard; Design Item ID: ICM-42688-P; Case/Package: None
S2 = CMP-010-00024-1: High-performance 6-axis inertial sensor (accelerometer + gyroscope) <a href="https://pricing.snapeda.com/parts/BMI088/Bosch%20Sensortec/view-part?ref=eda">Check prices</a>; Design Item ID: BMI088; Source: BMI088.SchLib; Case/Package: None; Value: *; Availability: Unavailable; Component Type: Standard; Pins: 16; Price: None; MP: BMI088
S3 = CMP-010-00025-1: Accelerometer, Gyroscope, 6 Axis Sensor I2C, I3C, SPI Output; MF: TDK InvenSense; Design Item ID: ICM-45686; Component Type: Standard; Check_prices: https://www.snapeda.com/parts/ICM-45686/TDK+InvenSense/view-part/?ref=eda; Case/Package: Package; SnapEDA_Link: https://www.snapeda.com/parts/ICM-45686/TDK+InvenSense/view-part/?ref=snap; Pins: 14; Source: ICM-45686.SchLib; MP: ICM-45686; Value: *

## Sheet S5_Memory_Ram.SchDoc
size 420 x 297 mm; SheetNumber: 5; SheetTotal: 11
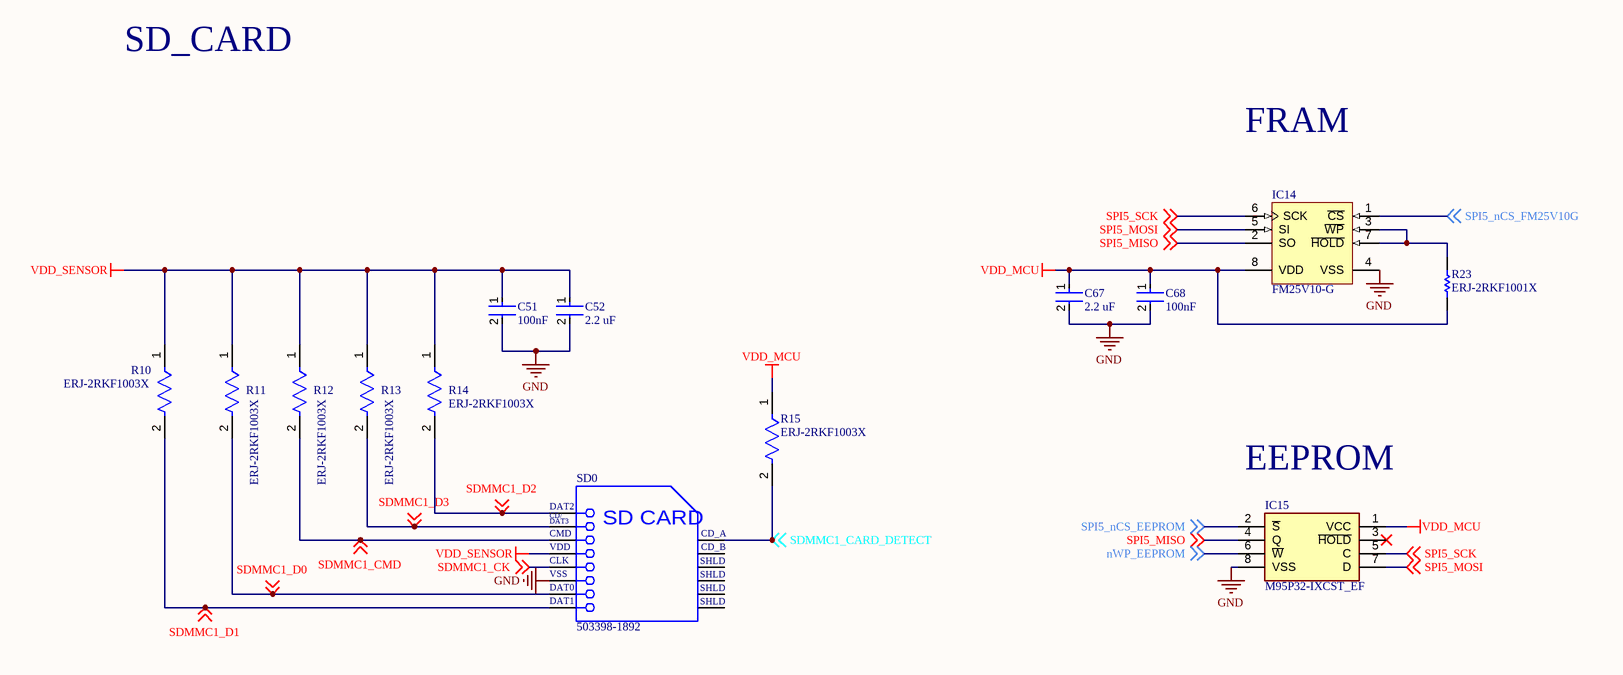
[diagram p3: S5_Memory_Ram.SchDoc]

### Parts
C51  100nF  [FP-CC0402-MFG]
C52  2.2 uF  [FP-C1005-050-IPC_A]
C67  2.2 uF  [FP-C1005-050-IPC_A]
C68  100nF  [FP-CC0402-MFG]
IC14  FM25V10-G  [CYP-S08.15_M]
IC15  M95P32-IXCST_EF  [M95P32IXCSTEF]
R10  ERJ-2RKF1003X  [FP-ERJ2RK-IPC_C]
R11  ERJ-2RKF1003X  [FP-ERJ2RK-IPC_C]
R12  ERJ-2RKF1003X  [FP-ERJ2RK-IPC_C]
R13  ERJ-2RKF1003X  [FP-ERJ2RK-IPC_C]
R14  ERJ-2RKF1003X  [FP-ERJ2RK-IPC_C]
R15  ERJ-2RKF1003X  [FP-ERJ2RK-IPC_C]
R23  ERJ-2RKF1001X  [RESC1005X40X25NL05T05]
SD0  503398-1892  [MOLX-503398-1892_V]

### Nets
GND: C51.2 C52.2 C67.2 C68.2 IC14.4(VSS) IC15.8(VSS) SD0.6(VSS)
VDD_MCU: C67.1 C68.1 IC14.8(VDD) IC15.1(VCC) R15.1 R23.2
VDD_SENSOR: C51.1 C52.1 R10.1 R11.1 R12.1 R13.1 R14.1 SD0.4(VDD)
nWP_EEPROM: IC15.6(~{W}) ; off-sheet nWP_EEPROM
SDMMC1_CARD_DETECT: R15.2 SD0.9(CD_A) ; off-sheet SDMMC1_CARD_DETECT
SDMMC1_CK: SD0.5(CLK) ; off-sheet SDMMC1_CK
SDMMC1_CMD: R12.2 SD0.3(CMD) ; off-sheet SDMMC1_CMD
SDMMC1_D0: R11.2 SD0.7(DAT0) ; off-sheet SDMMC1_D0
SDMMC1_D1: R10.2 SD0.8(DAT1) ; off-sheet SDMMC1_D1
SDMMC1_D2: R14.2 SD0.1(DAT2) ; off-sheet SDMMC1_D2
SDMMC1_D3: R13.2 SD0.2(CD/DAT3) ; off-sheet SDMMC1_D3
SPI5_MISO: IC14.2(SO) IC15.4(Q) ; off-sheet SPI5_MISO
SPI5_MOSI: IC14.5(SI) IC15.7(D) ; off-sheet SPI5_MOSI
SPI5_nCS_EEPROM: IC15.2(~{S}) ; off-sheet SPI5_nCS_EEPROM
SPI5_nCS_FM25V10G: IC14.1(~{CS}) ; off-sheet SPI5_nCS_FM25V10G
SPI5_SCK: IC14.6(SCK) IC15.5(C) ; off-sheet SPI5_SCK
NetIC14_3: IC14.3(~{WP}) IC14.7(~{HOLD}) R23.1

Not connected (* = marked no-connect by the designer): IC15 3(~{HOLD})*; SD0 10(CD_B) 11(SHLD) 12(SHLD) 13(SHLD) 14(SHLD)

### Notes on the sheet
- SD_CARD
- FRAM
- (near IC15) EEPROM
- THIS DOCUMENT AND THE DATA DISCLOSED HEREIN OR
- HEREWITH IS THE PROPERTY OF ALTIUM LIMITED AND MAY
- DWG NO:
- REVISION
- REV:
- DESCRIPTION
- DATE
- APPROVED
- BE FREELY DISTRIBUTED IN WHOLE. NO RIGHTS ARE
- RESERVED OR EXPRESS OR IMPLIED WARANTEE GIVEN.
- ENG:
- APPROVALS
- PROJECT
- DSN:
- CHK:
- REFERENCE DOCUMENTS
- PROJECT REVISION:
- TITLE
- DOCUMENT REVISION:
- DESIGN ITEM:
- BOM:
- FAB DWG:
- PCB DWG:
- ASSY DWG:
- SCALE:
- A3
- SIZE
- CAGE CODE
- FILE NAME
- DWG NO.
- SHEET
- OF
- REV
- (in symbol CMP-2000-05621-1) CD/; DAT3; SD CARD

### Library data of the parts
C51 C68 = CMP-03422-001121-1: as C4 on sheet S1_MCU; Digikey Description: CAP CER 0.1UF 16V X7R 0402; Temperature Range Low: -55°C; Footprint Url: http://www.yageo.com/exep/pages/download/literatures/UPY-C_GEN_24.pdf; RoHS: TRUE; Device Class L3: Ceramic Capacitors; Temperature Characteristic: X7R; Capacitance: 100 nF; Package: CC0402; Device Class L1: Passive Components; Lead Free: Yes; Temperature Range High: +125°C; Category: Cap; Mouser Description: 0402 0.1 uF 16 V ±10% Tolerance X7R SMT Multilayer Ceramic Capacitor; Voltage Rating: 16 V; Value: 100 nF; ComponentLink2Description: Datasheet; Automotive: No; Octopart: https://octopart.com/cc0402kpx7r7bb104-yageo-21548559; ComponentLink2URL: http://www.yageo.com/documents/recent/UPY-GP_NP0_16V-to-50V_16.pdf; Height: 0.55mm; Device Class L2: Capacitors; Temperature: -55°C to +125°C; Ipc Land Pattern Name: CAPC10050X50
C52 C67 = CMP-08246-004339-1: as C1 on sheet S1_MCU; REACH SVHC: No SVHC; Weight: 2.3E-05oz; Capacitance: 2.2uF; Length: 1mm; RoHS Compliant: Yes; Package Quantity: 1; Voltage Rating (DC): 25V; Dielectric: X5R; Series: C; Voltage Rating: 25V; Case Code (Imperial): 0402; Min Operating Temperature: -55°C; Depth: 0.5mm; Resistor Type: Ceramic; Height: 0.5mm; Width: 0.5mm; Mount: Surface Mount; Case Code (Metric): 1005; Case/Package: 0402; Max Operating Temperature: 85°C; Thickness: 0.022inch; Lead Free: Lead Free; Termination: SMD/SMT; Packaging: Tape and Reel
IC14 = CMP-1640-00001-1: 1-Mbit Serial F-RAM, 2 to 3.6 V, -40 to 85 degC, 8-Pin SOIC (S08.15), RoHS, Tube; Supply Voltage Min: 2 V; Memory Size: 1 Mbits; Access Time: 18 ns; Supply Voltage Max: 3.6 V; Temperature Min: -40 degC; Temperature Max: 85 degC; ComponentLink3Description: Package Specification; Code_JEDEC: MS-012; ComponentLink1Description: Manufacturer URL; RoHS: TRUE; ComponentLink3URL: http://www.mill-max.com/assets/pdfs/metric/007M.PDF; Generic Part Number: FM25V10; ComponentLink1URL: http://www.cypress.com/; PackageDescription: 8-Pin SOIC, Body 4.9 x 3.9 mm, Pitch 1.27 mm; ComponentLink2URL: http://www.cypress.com/file/41691/download; PackageVersion: Rev. *D, 12/2009; ComponentLink2Description: Datasheet; PartNumber: FM25V10-G; Mounting Technology: Surface Mount; Packing: Tube; DatasheetVersion: Rev. *F
IC15 = M95P32-IXCST_EF: Integrated Circuit; Manufacturer_Name: STMicroelectronics; Manufacturer_Part_Number: M95P32-IXCST/EF; Datasheet Link: https://www.st.com/resource/en/datasheet/m95p32-i.pdf; Height: 0.58mm; Mouser Part Number: 511-M95P32-IXCST/EF; Mouser Price/Stock: https://www.mouser.co.uk/ProductDetail/STMicroelectronics/M95P32-IXCST-EF?qs=rQFj71Wb1eVk689cPUP7pg%3D%3D; Arrow Part Number: M95P32-IXCST/EF; Arrow Price/Stock: https://www.arrow.com/en/products/m95p32-ixcstef/stmicroelectronics?utm_currency=USD&region=nac
R10-R15 = CMP-2002-00608-4: RES SMD 100K OHM 1% 1/10W 0402; Resistance: 100kR; Voltage Rating (DC): 50V; Power Rating: 100mW; Temperature Coefficient: 100ppm/°C; Case/Package: 0402; Length: 1mm; Package Quantity: 1; Radiation Hardening: No; Case Code (Metric): 1005; Contact Plating: Tin; Mount: Surface Mount; Depth: 0.5mm; Max Operating Temperature: 155°C; Lead Free: Lead Free; Width: 0.5mm; Composition: Thick Film; Case Code (Imperial): 0402; Tolerance: 1%; Termination: SMD/SMT; Number of Pins: 2; Height: 0.35mm; Voltage Rating: 50V; Military Standard: Not; REACH SVHC: No SVHC; Packaging: Tape and Reel; Min Operating Temperature: -55°C; Max Power Dissipation: 100mW; Features: Automotive AEC-Q200; Number of Terminations: 2
R23 = CMP-1011-00510-4: Chip Resistor, 1 KOhm, +/- 1%, 100 mW, -55 to 155 degC, 0402 (1005 Metric), RoHS, Tape and Reel; Manufacturer: Basic Passives; Voltage Rating: 50 V; Case\/Package: 0402; Resistance: 1 KOhm; Power Rating: 100 mW; PartNumber: ERJ-2RKF1001X; DatasheetVersion: 04/2015; Radiation Hardening: No; Pins: 2; Height: 0.35 mm; RoHSCompliant: true; Case Code (Imperial): 0402; ComponentLink2Description: Datasheet; ComponentLink1Description: Manufacturer URL; PackageReference: 0402; Mount: Surface Mount; Package Quantity: 10000; Tolerance: 1%; ComponentLink1URL: http://www.panasonic.com/; PackageDescription: 2-Pin Surface Mount Device, Body 1 x 0.5 mm; Mounting Technology: Surface Mount; Case Code (Metric): 1005; ComponentLink2URL: http://industrial.panasonic.com/cdbs/www-data/pdf/RDA0000/AOA0000C86.pdf; REACH SVHC: Yes; Packaging: Tape and Reel; Max Operating Temperature: 155 degC; Min Operating Temperature: -55 degC; Width: 0.5 mm; Length: 1 mm
SD0 = CMP-2000-05621-1: Micro SD Connector, Pitch 1.1 mm, 8 Position, Height 1.4 mm, -25 to 85 degC, RoHS, Tape and Reel; Manufacturer: Molex; Voltage Rating: 10VAC/DC; Current Rating: 500mA; Manufacturer URL: http://www.molex.com/; Package Reference: 503398-1892; Packaging: Reel; RoHS: Details; Brand: Molex; Datasheet URL: http://www.molex.com/pdm_docs/sd/5033981892_sd.pdf; Mounting Technology: SurfaceMount; Factory Pack Quantity: 2400; Datasheet Version: Rev. E, 04/2006; Series: 503398; Product Category: MemoryCardConnectors; Package Description: Micro SD Connector, Pitch 1.1 mm, 8 Position, Height 1.4 mm

## Sheet S4_Baro_Mag.SchDoc
size 420 x 297 mm; SheetNumber: 4; SheetTotal: 11
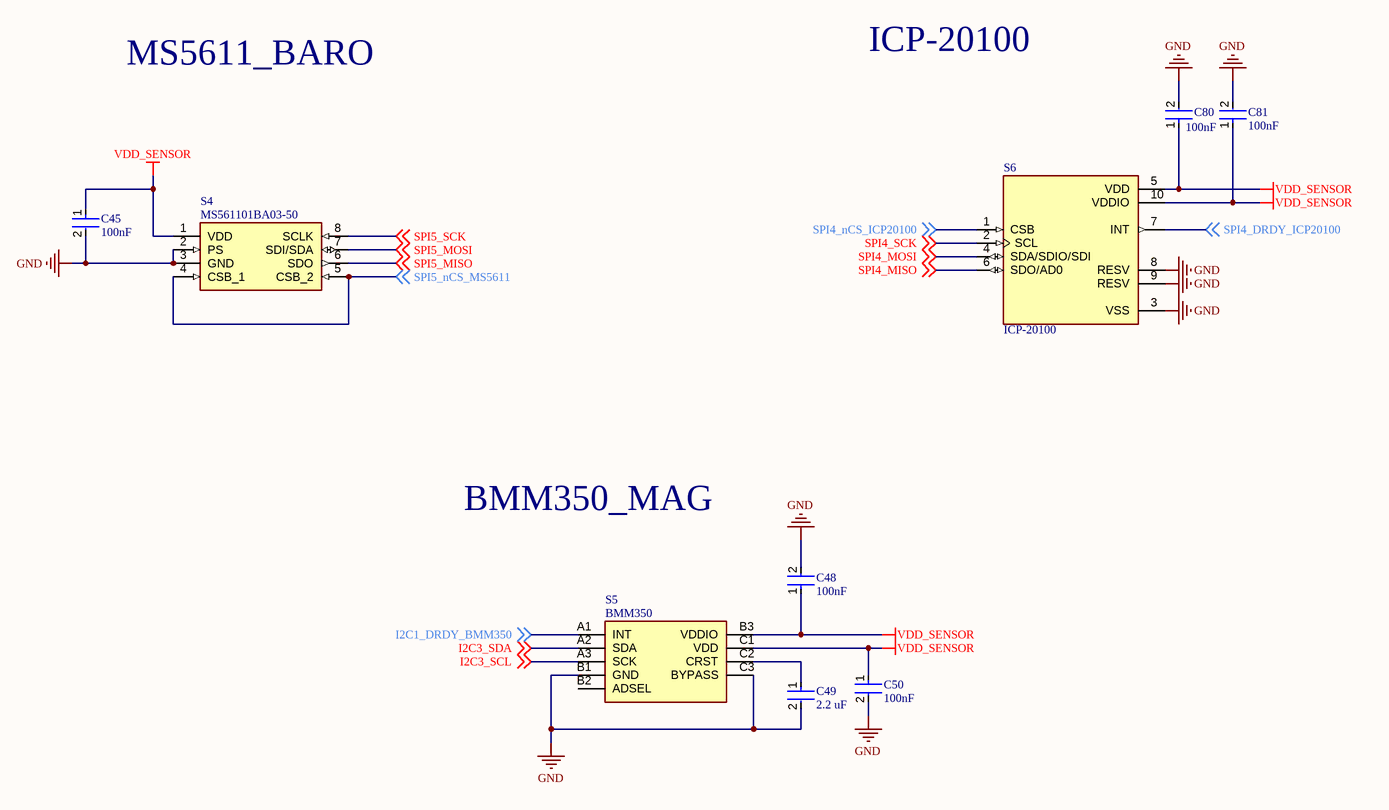
[diagram p4: S4_Baro_Mag.SchDoc]

### Parts
C45  100nF  [FP-CC0402-MFG]
C48  100nF  [FP-CC0402-MFG]
C49  2.2 uF  [FP-C1005-050-IPC_A]
C50  100nF  [FP-CC0402-MFG]
C80  100nF  [FP-CC0402-MFG]
C81  100nF  [FP-CC0402-MFG]
S4  MS561101BA03-50  [MS561101BA03-50]
S5  BMM350  [BGA9C40P3X3_128X128X54]
S6  ICP-20100  [PQFN50P200X200X85-10N]

### Nets
GND: C45.2 C48.2 C49.2 C50.2 C80.2 C81.2 S4.2(PS) S4.3(GND) S5.B1(GND) S5.C3(BYPASS) S6.3(VSS) S6.8(RESV) S6.9(RESV)
VDD_SENSOR: C45.1 C48.1 C50.1 C80.1 C81.1 S4.1(VDD) S5.B3(VDDIO) S5.C1(VDD) S6.5(VDD) S6.10(VDDIO)
I2C1_DRDY_BMM350: S5.A1(INT) ; off-sheet I2C1_DRDY_BMM350
I2C3_SCL: S5.A3(SCK) ; off-sheet I2C3_SCL
I2C3_SDA: S5.A2(SDA) ; off-sheet I2C3_SDA
SPI4_DRDY_ICP20100: S6.7(INT) ; off-sheet SPI4_DRDY_ICP20100
SPI4_MISO: S6.6(SDO/AD0) ; off-sheet SPI4_MISO
SPI4_MOSI: S6.4(SDA/SDIO/SDI) ; off-sheet SPI4_MOSI
SPI4_nCS_ICP20100: S6.1(CSB) ; off-sheet SPI4_nCS_ICP20100
SPI4_SCK: S6.2(SCL) ; off-sheet SPI4_SCK
SPI5_MISO: S4.6(SDO) ; off-sheet SPI5_MISO
SPI5_MOSI: S4.7(SDI/SDA) ; off-sheet SPI5_MOSI
SPI5_nCS_MS5611: S4.4(CSB_1) S4.5(CSB_2) ; off-sheet SPI5_nCS_MS5611
SPI5_SCK: S4.8(SCLK) ; off-sheet SPI5_SCK
NetC49_1: C49.1 S5.C2(CRST)

Not connected (* = marked no-connect by the designer): S5 B2(ADSEL)

### Notes on the sheet
- MS5611_BARO
- ICP-20100
- BMM350_MAG
- THIS DOCUMENT AND THE DATA DISCLOSED HEREIN OR
- HEREWITH IS THE PROPERTY OF ALTIUM LIMITED AND MAY
- DWG NO:
- REVISION
- REV:
- DESCRIPTION
- DATE
- APPROVED
- BE FREELY DISTRIBUTED IN WHOLE. NO RIGHTS ARE
- RESERVED OR EXPRESS OR IMPLIED WARANTEE GIVEN.
- ENG:
- APPROVALS
- PROJECT
- DSN:
- CHK:
- REFERENCE DOCUMENTS
- PROJECT REVISION:
- TITLE
- DOCUMENT REVISION:
- DESIGN ITEM:
- BOM:
- FAB DWG:
- PCB DWG:
- ASSY DWG:
- SCALE:
- A3
- SIZE
- CAGE CODE
- FILE NAME
- DWG NO.
- SHEET
- OF
- REV

### Library data of the parts
C45 C48 C50 C80 C81 = CMP-03422-001121-1: as C4 on sheet S1_MCU; Digikey Description: CAP CER 0.1UF 16V X7R 0402; Temperature Range Low: -55°C; Footprint Url: http://www.yageo.com/exep/pages/download/literatures/UPY-C_GEN_24.pdf; RoHS: TRUE; Device Class L3: Ceramic Capacitors; Temperature Characteristic: X7R; Capacitance: 100 nF; Package: CC0402; Device Class L1: Passive Components; Lead Free: Yes; Temperature Range High: +125°C; Category: Cap; Mouser Description: 0402 0.1 uF 16 V ±10% Tolerance X7R SMT Multilayer Ceramic Capacitor; Voltage Rating: 16 V; Value: 100 nF; ComponentLink2Description: Datasheet; Automotive: No; Octopart: https://octopart.com/cc0402kpx7r7bb104-yageo-21548559; ComponentLink2URL: http://www.yageo.com/documents/recent/UPY-GP_NP0_16V-to-50V_16.pdf; Height: 0.55mm; Device Class L2: Capacitors; Temperature: -55°C to +125°C; Ipc Land Pattern Name: CAPC10050X50
C49 = CMP-08246-004339-1: as C1 on sheet S1_MCU; REACH SVHC: No SVHC; Weight: 2.3E-05oz; Capacitance: 2.2uF; Length: 1mm; RoHS Compliant: Yes; Package Quantity: 1; Voltage Rating (DC): 25V; Dielectric: X5R; Series: C; Voltage Rating: 25V; Case Code (Imperial): 0402; Min Operating Temperature: -55°C; Depth: 0.5mm; Resistor Type: Ceramic; Height: 0.5mm; Width: 0.5mm; Mount: Surface Mount; Case Code (Metric): 1005; Case/Package: 0402; Max Operating Temperature: 85°C; Thickness: 0.022inch; Lead Free: Lead Free; Termination: SMD/SMT; Packaging: Tape and Reel
S4 = MS561101BA03-50: Integrated Circuit; Manufacturer_Name: TE Connectivity; Datasheet Link: https://www.te.com/commerce/DocumentDelivery/DDEController?Action=srchrtrv&DocNm=MS5611-01BA03&DocType=Data%20Sheet&DocLang=English&PartCntxt=MS561101BA03-50&DocFormat=pdf; Manufacturer_Part_Number: MS561101BA03-50; Mouser Part Number: 824-MS561101BA03-50; Mouser Price/Stock: https://www.mouser.co.uk/ProductDetail/Measurement-Specialties/MS561101BA03-50?qs=%252BgKeJhng5iV%252BnCz6Qd5iDw%3D%3D; Arrow Part Number: MS561101BA03-50; Arrow Price/Stock: https://www.arrow.com/en/products/ms561101ba03-50/te-connectivity?region=nac
S5 = BMM350: Integrated Circuit; Manufacturer_Name: BOSCH; Datasheet Link: https://www.bosch-sensortec.com/media/boschsensortec/downloads/datasheets/bst-bmm350-ds001.pdf; Height: 0.54mm; Manufacturer_Part_Number: BMM350; Mouser Part Number: 262-BMM350; Mouser Price/Stock: https://www.mouser.co.uk/ProductDetail/Bosch-Sensortec/BMM350?qs=amGC7iS6iy9v98dnmxozLQ%3D%3D; Arrow Part Number: BMM350; Arrow Price/Stock: https://www.arrow.com/en/products/bmm350/bosch?region=nac
S6 = CMP-010-00027-1: MF: TDK InvenSense; Availability: Not in stock; SnapEDA_Link: https://www.snapeda.com/parts/ICP-20100/TDK%20InvenSense/view-part/7331147/?ref=snap; Check_prices: https://www.snapeda.com/parts/ICP-20100/TDK%20InvenSense/view-part/7331147/?ref=eda; Source: ICP-20100.SchLib; Pins: 10; Value: *; Component Type: Standard; Case/Package: None; Design Item ID: ICP-20100; Price: None; MP: ICP-20100

## Sheet S6_Pwm.SchDoc
size 420 x 297 mm; SheetNumber: 6; SheetTotal: 11
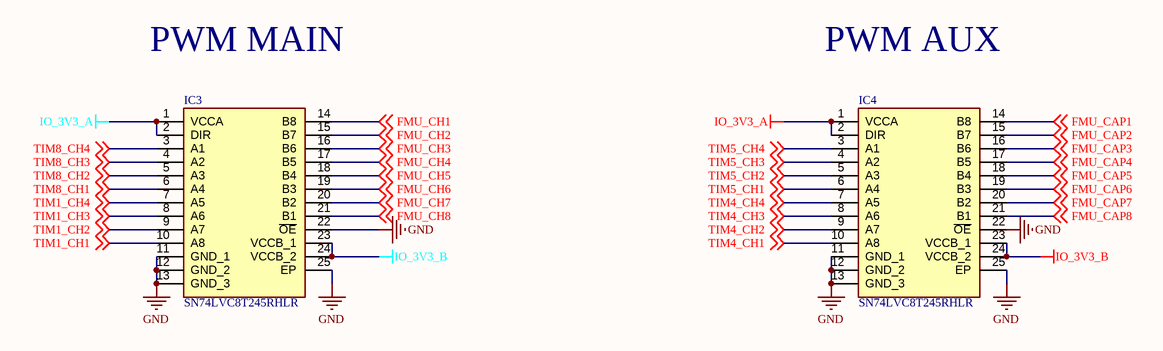
[diagram p5: S6_Pwm.SchDoc]

### Parts
IC3  SN74LVC8T245RHLR  [RHL_(R-PVQFN-N24)]
IC4  SN74LVC8T245RHLR  [RHL_(R-PVQFN-N24)]

### Nets
GND: IC3.11(GND_1) IC3.12(GND_2) IC3.13(GND_3) IC3.22(~{OE}) IC3.25(EP) IC4.11(GND_1) IC4.12(GND_2) IC4.13(GND_3) IC4.22(~{OE}) IC4.25(EP)
IO_3V3_A: IC3.1(VCCA) IC3.2(DIR) IC4.1(VCCA) IC4.2(DIR)
IO_3V3_B: IC3.23(VCCB_1) IC3.24(VCCB_2) IC4.23(VCCB_1) IC4.24(VCCB_2)
FMU_CAP1: IC4.14(B8) ; off-sheet FMU_CAP1
FMU_CAP2: IC4.15(B7) ; off-sheet FMU_CAP2
FMU_CAP3: IC4.16(B6) ; off-sheet FMU_CAP3
FMU_CAP4: IC4.17(B5) ; off-sheet FMU_CAP4
FMU_CAP5: IC4.18(B4) ; off-sheet FMU_CAP5
FMU_CAP6: IC4.19(B3) ; off-sheet FMU_CAP6
FMU_CAP7: IC4.20(B2) ; off-sheet FMU_CAP7
FMU_CAP8: IC4.21(B1) ; off-sheet FMU_CAP8
FMU_CH1: IC3.14(B8) ; off-sheet FMU_CH1
FMU_CH2: IC3.15(B7) ; off-sheet FMU_CH2
FMU_CH3: IC3.16(B6) ; off-sheet FMU_CH3
FMU_CH4: IC3.17(B5) ; off-sheet FMU_CH4
FMU_CH5: IC3.18(B4) ; off-sheet FMU_CH5
FMU_CH6: IC3.19(B3) ; off-sheet FMU_CH6
FMU_CH7: IC3.20(B2) ; off-sheet FMU_CH7
FMU_CH8: IC3.21(B1) ; off-sheet FMU_CH8
TIM1_CH1: IC3.10(A8) ; off-sheet TIM1_CH1
TIM1_CH2: IC3.9(A7) ; off-sheet TIM1_CH2
TIM1_CH3: IC3.8(A6) ; off-sheet TIM1_CH3
TIM1_CH4: IC3.7(A5) ; off-sheet TIM1_CH4
TIM4_CH1: IC4.10(A8) ; off-sheet TIM4_CH1
TIM4_CH2: IC4.9(A7) ; off-sheet TIM4_CH2
TIM4_CH3: IC4.8(A6) ; off-sheet TIM4_CH3
TIM4_CH4: IC4.7(A5) ; off-sheet TIM4_CH4
TIM5_CH1: IC4.6(A4) ; off-sheet TIM5_CH1
TIM5_CH2: IC4.5(A3) ; off-sheet TIM5_CH2
TIM5_CH3: IC4.4(A2) ; off-sheet TIM5_CH3
TIM5_CH4: IC4.3(A1) ; off-sheet TIM5_CH4
TIM8_CH1: IC3.6(A4) ; off-sheet TIM8_CH1
TIM8_CH2: IC3.5(A3) ; off-sheet TIM8_CH2
TIM8_CH3: IC3.4(A2) ; off-sheet TIM8_CH3
TIM8_CH4: IC3.3(A1) ; off-sheet TIM8_CH4

### Notes on the sheet
- PWM MAIN
- PWM AUX
- THIS DOCUMENT AND THE DATA DISCLOSED HEREIN OR
- HEREWITH IS THE PROPERTY OF ALTIUM LIMITED AND MAY
- DWG NO:
- REVISION
- REV:
- DESCRIPTION
- DATE
- APPROVED
- BE FREELY DISTRIBUTED IN WHOLE. NO RIGHTS ARE
- RESERVED OR EXPRESS OR IMPLIED WARANTEE GIVEN.
- ENG:
- APPROVALS
- PROJECT
- DSN:
- CHK:
- REFERENCE DOCUMENTS
- PROJECT REVISION:
- TITLE
- DOCUMENT REVISION:
- DESIGN ITEM:
- BOM:
- FAB DWG:
- PCB DWG:
- ASSY DWG:
- SCALE:
- A3
- SIZE
- CAGE CODE
- FILE NAME
- DWG NO.
- SHEET
- OF
- REV

### Library data of the parts
IC3 IC4 = SN74LVC8T245RHLR: Integrated Circuit; Manufacturer_Name: Texas Instruments; Datasheet Link: http://www.ti.com/lit/gpn/sn74lvc8t245; Manufacturer_Part_Number: SN74LVC8T245RHLR; Mouser Part Number: 595-SN74LVC8T245RHLR; Mouser Price/Stock: https://www.mouser.co.uk/ProductDetail/Texas-Instruments/SN74LVC8T245RHLR?qs=dT9u2OTAaVWMeuErzytHQg%3D%3D; Arrow Part Number: SN74LVC8T245RHLR; Arrow Price/Stock: https://www.arrow.com/en/products/sn74lvc8t245rhlr/texas-instruments?region=nac